# Altium project PCB-PWR.PrjPcb
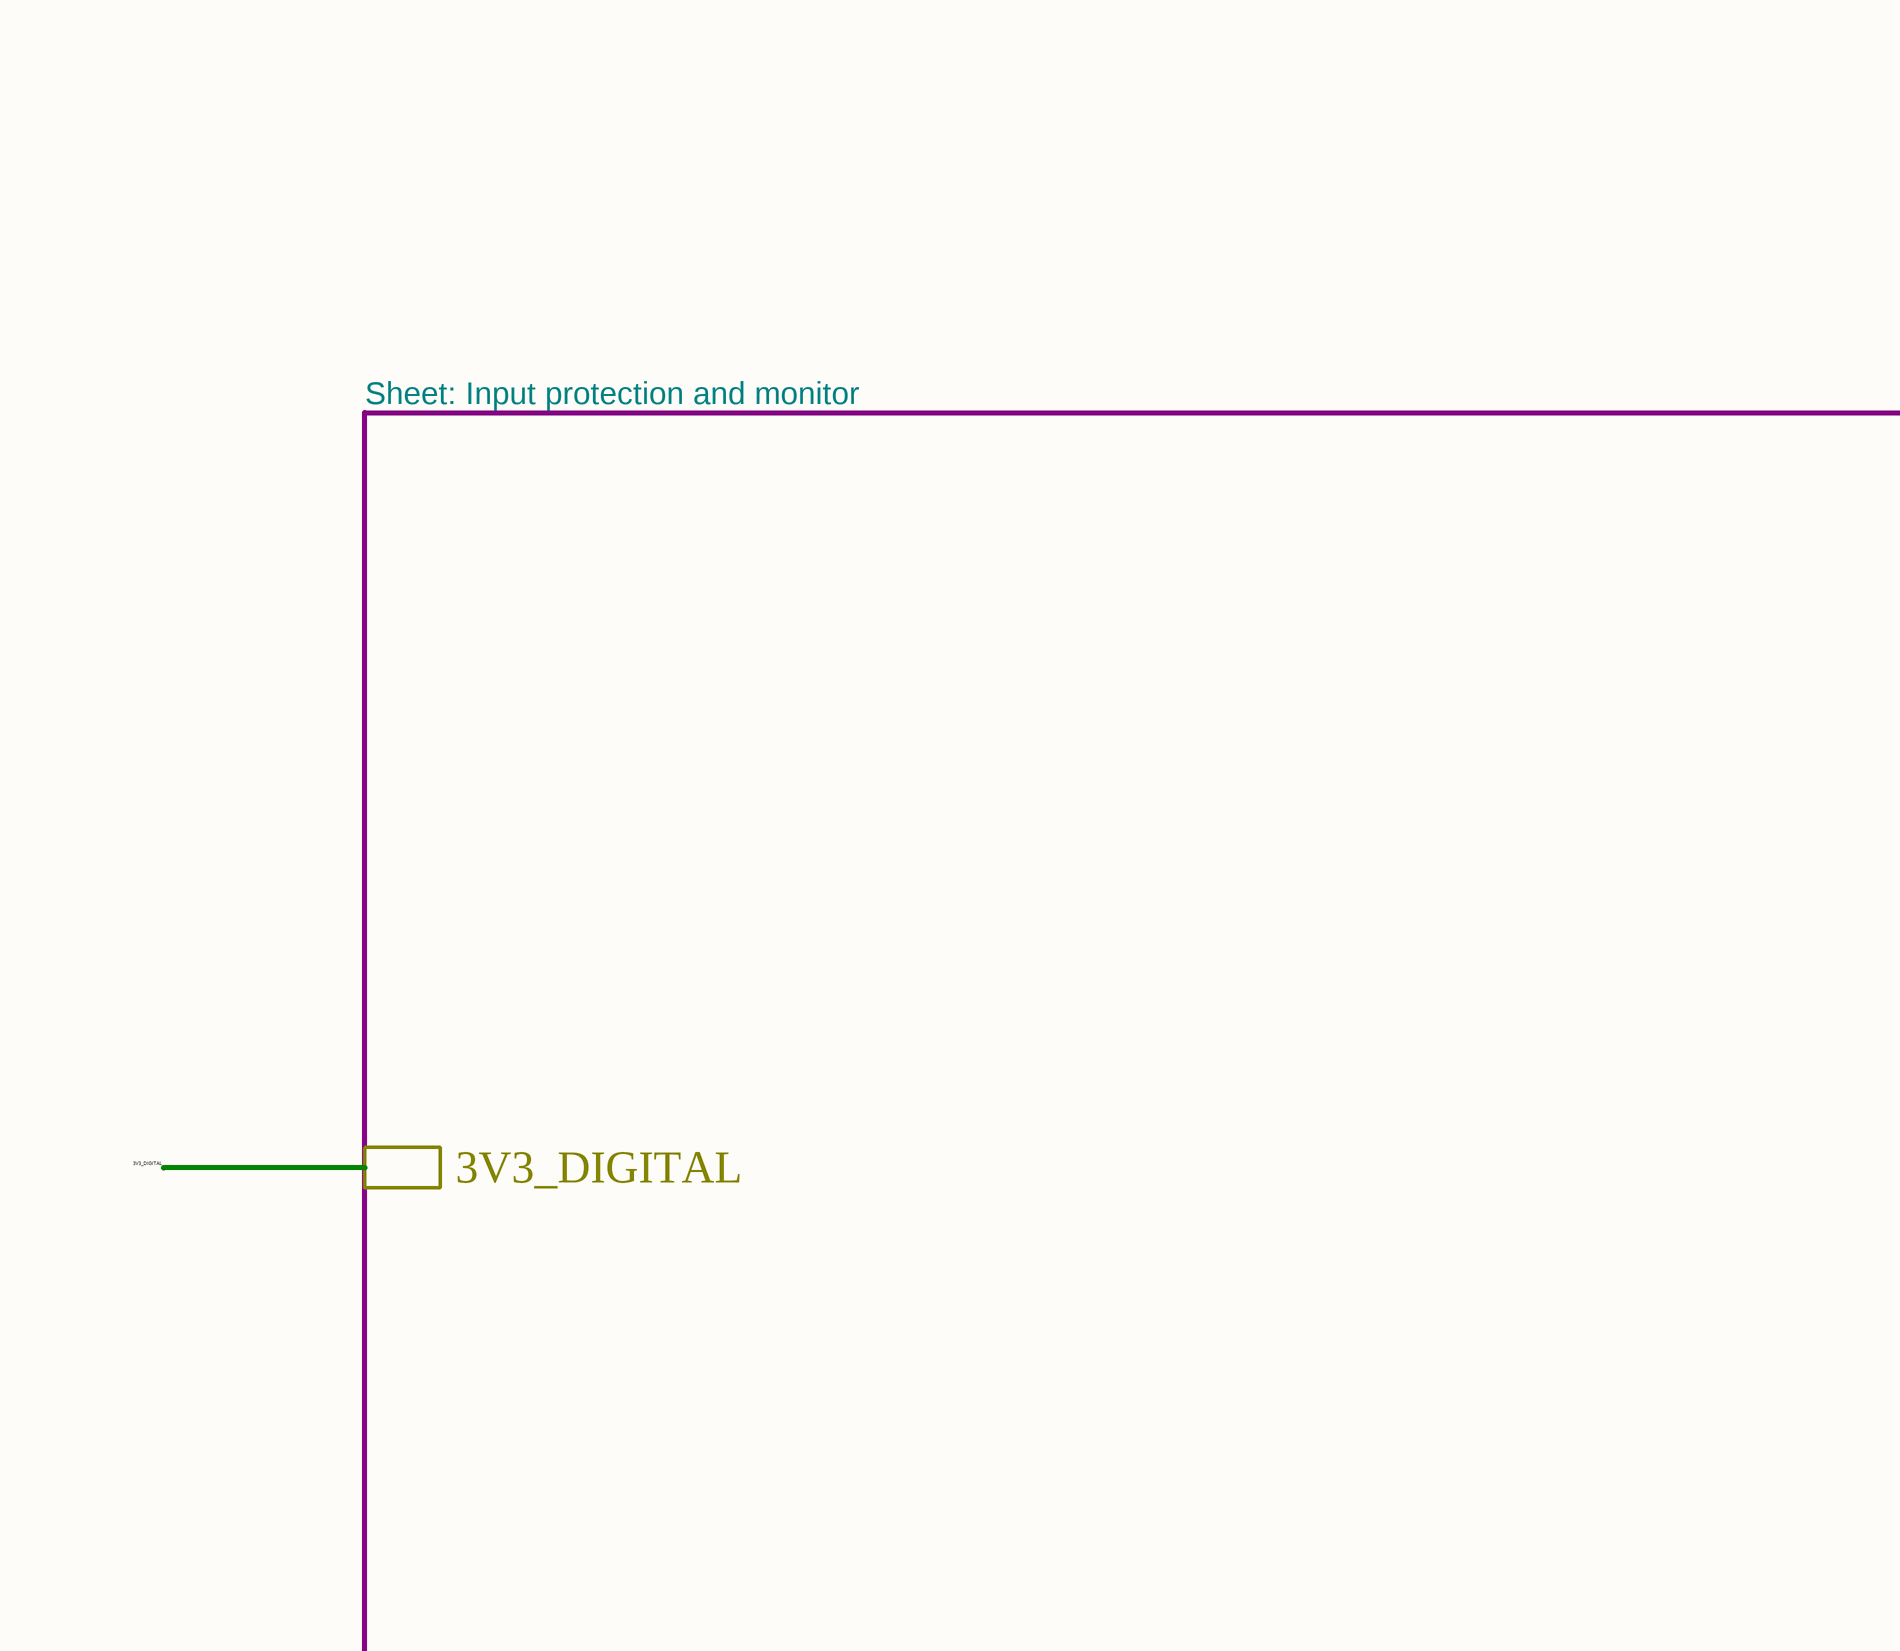
[diagram p0: PCB-PWR.SchDoc, top column 1 of 4]
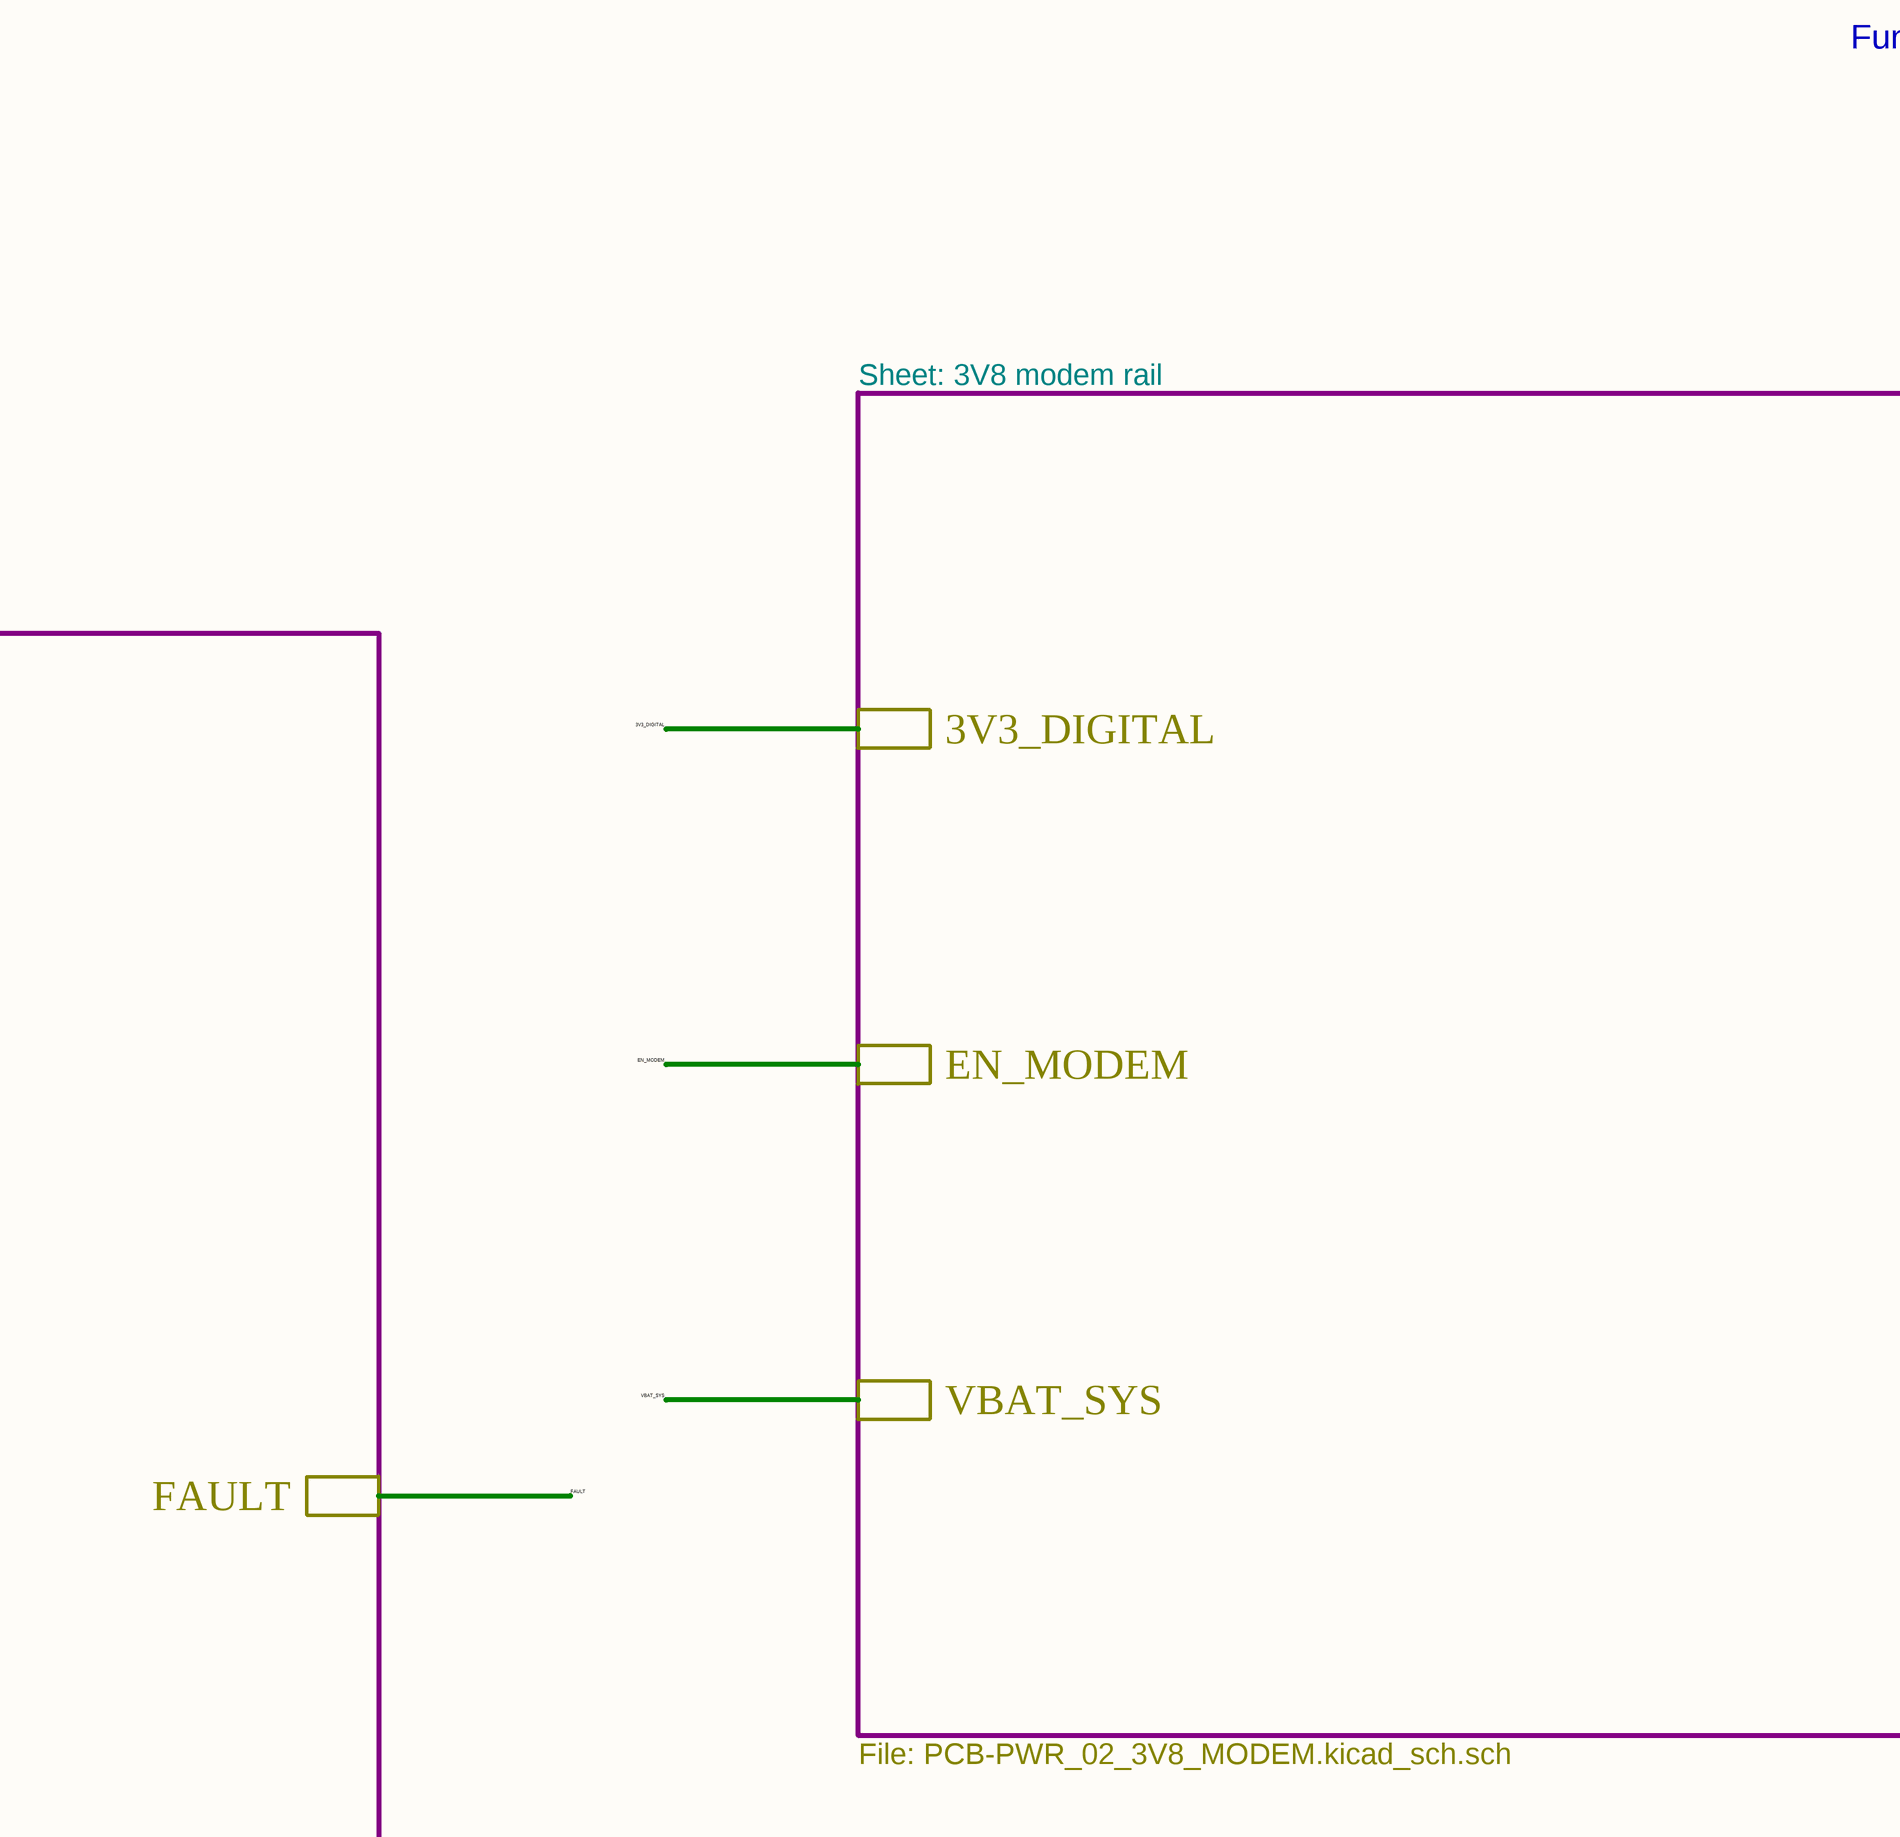
[diagram p1: PCB-PWR.SchDoc, top column 2 of 4]
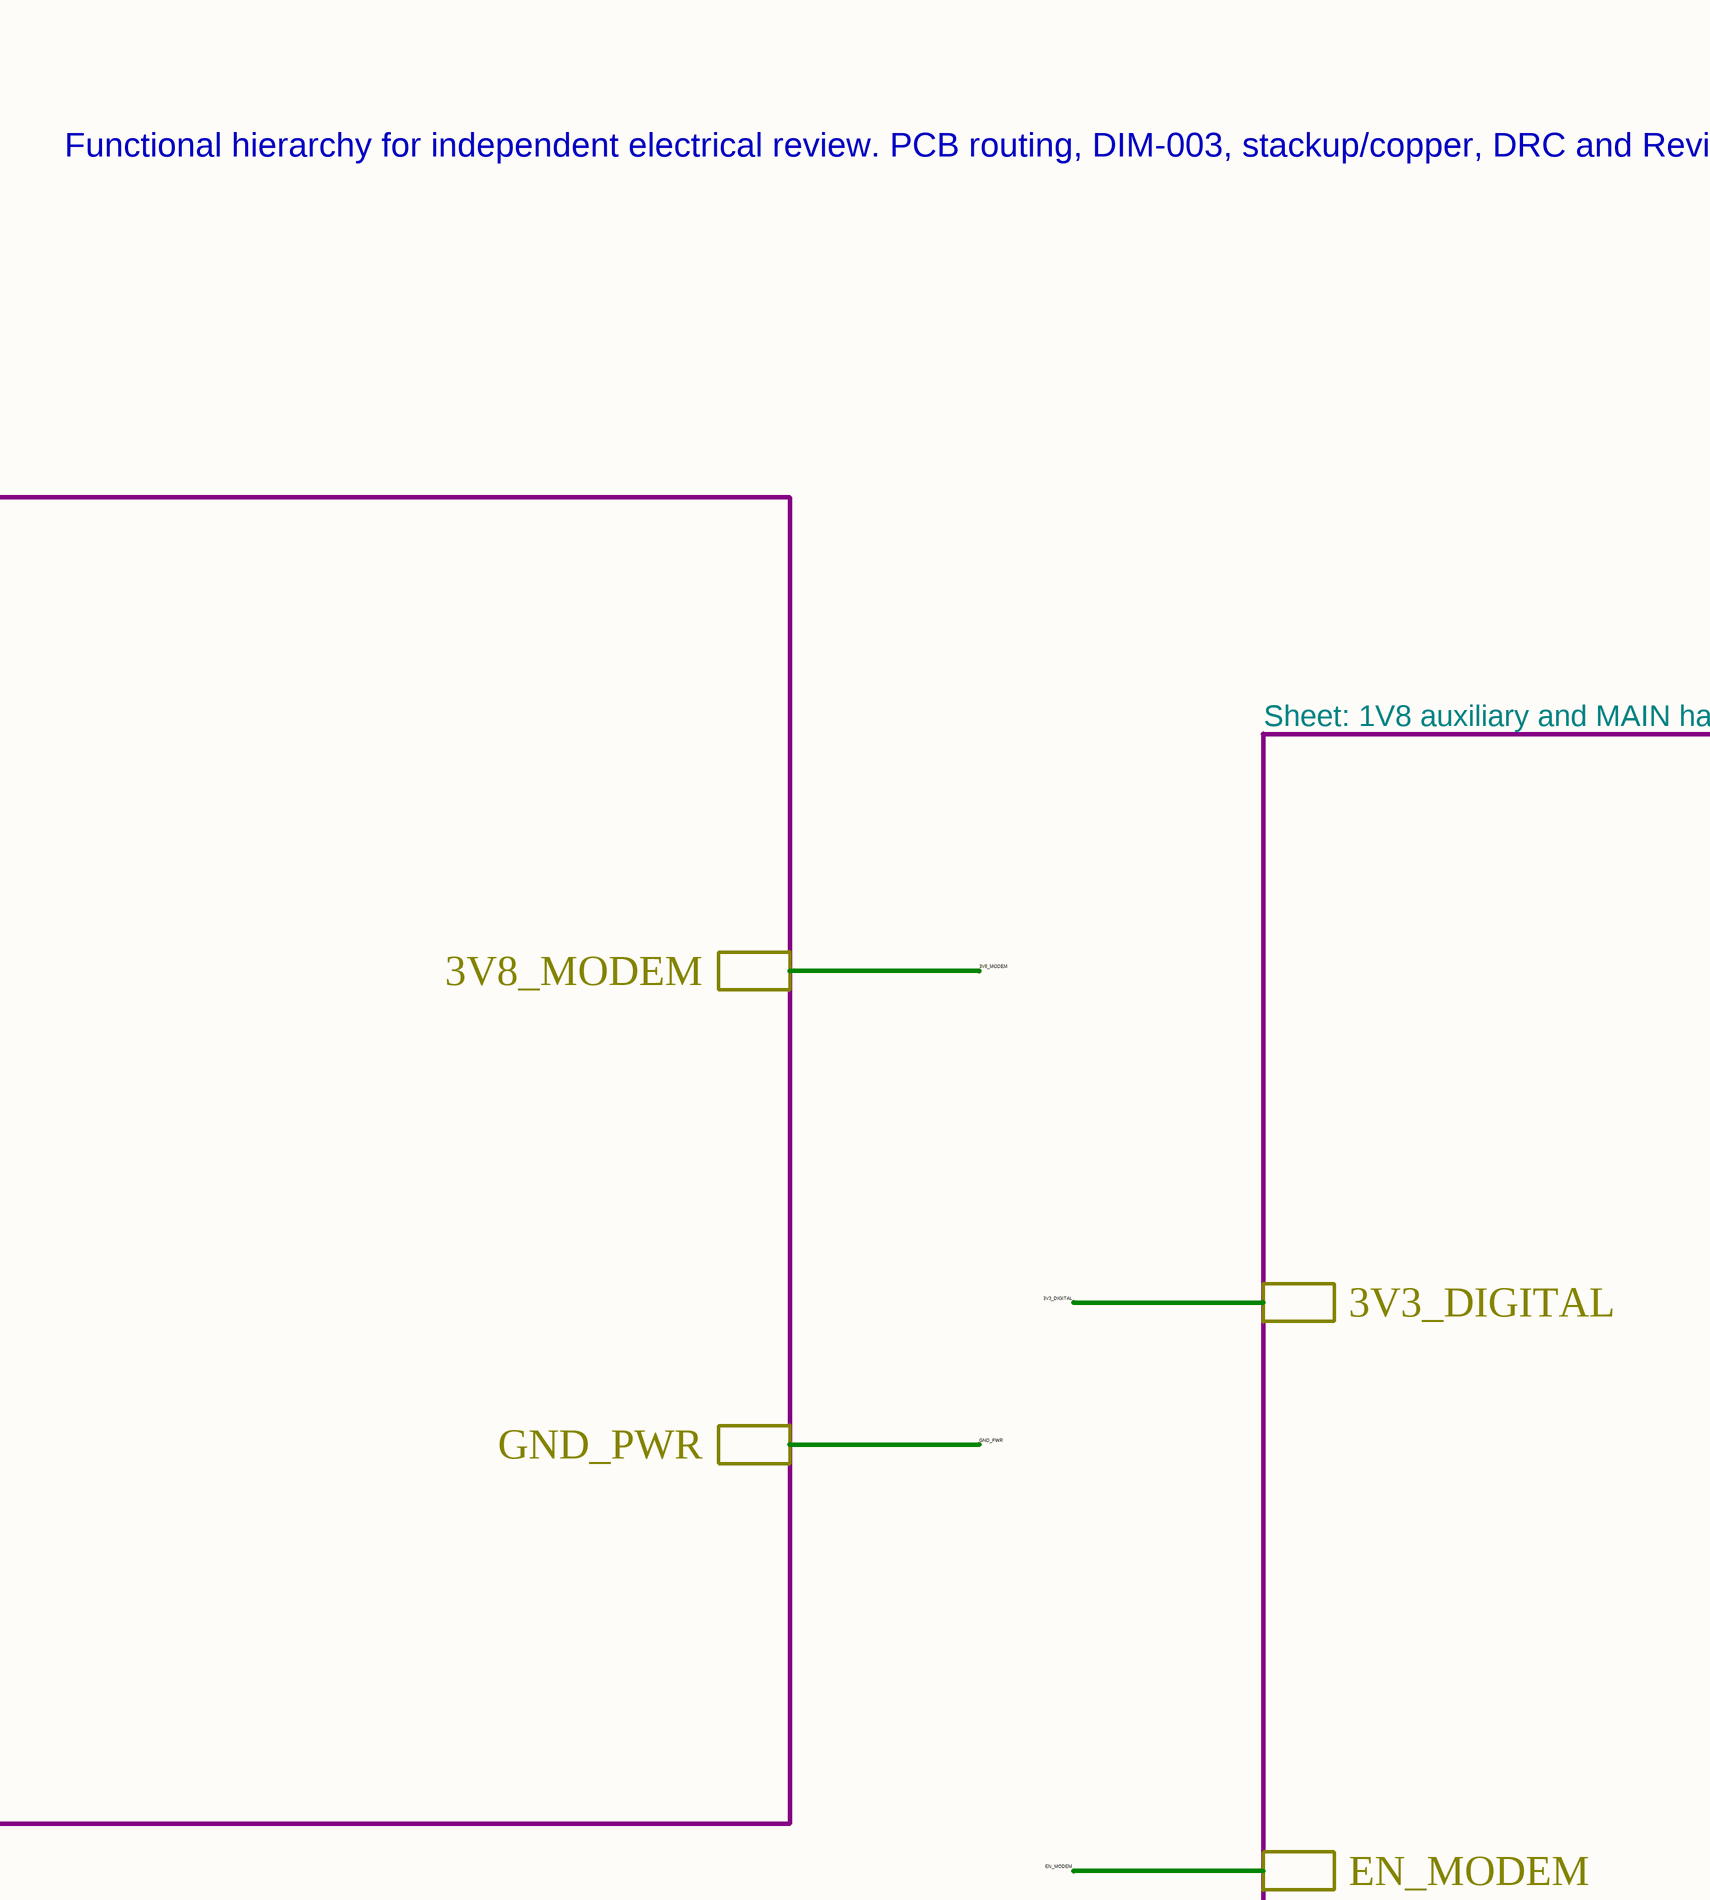
[diagram p2: PCB-PWR.SchDoc, top column 3 of 4]
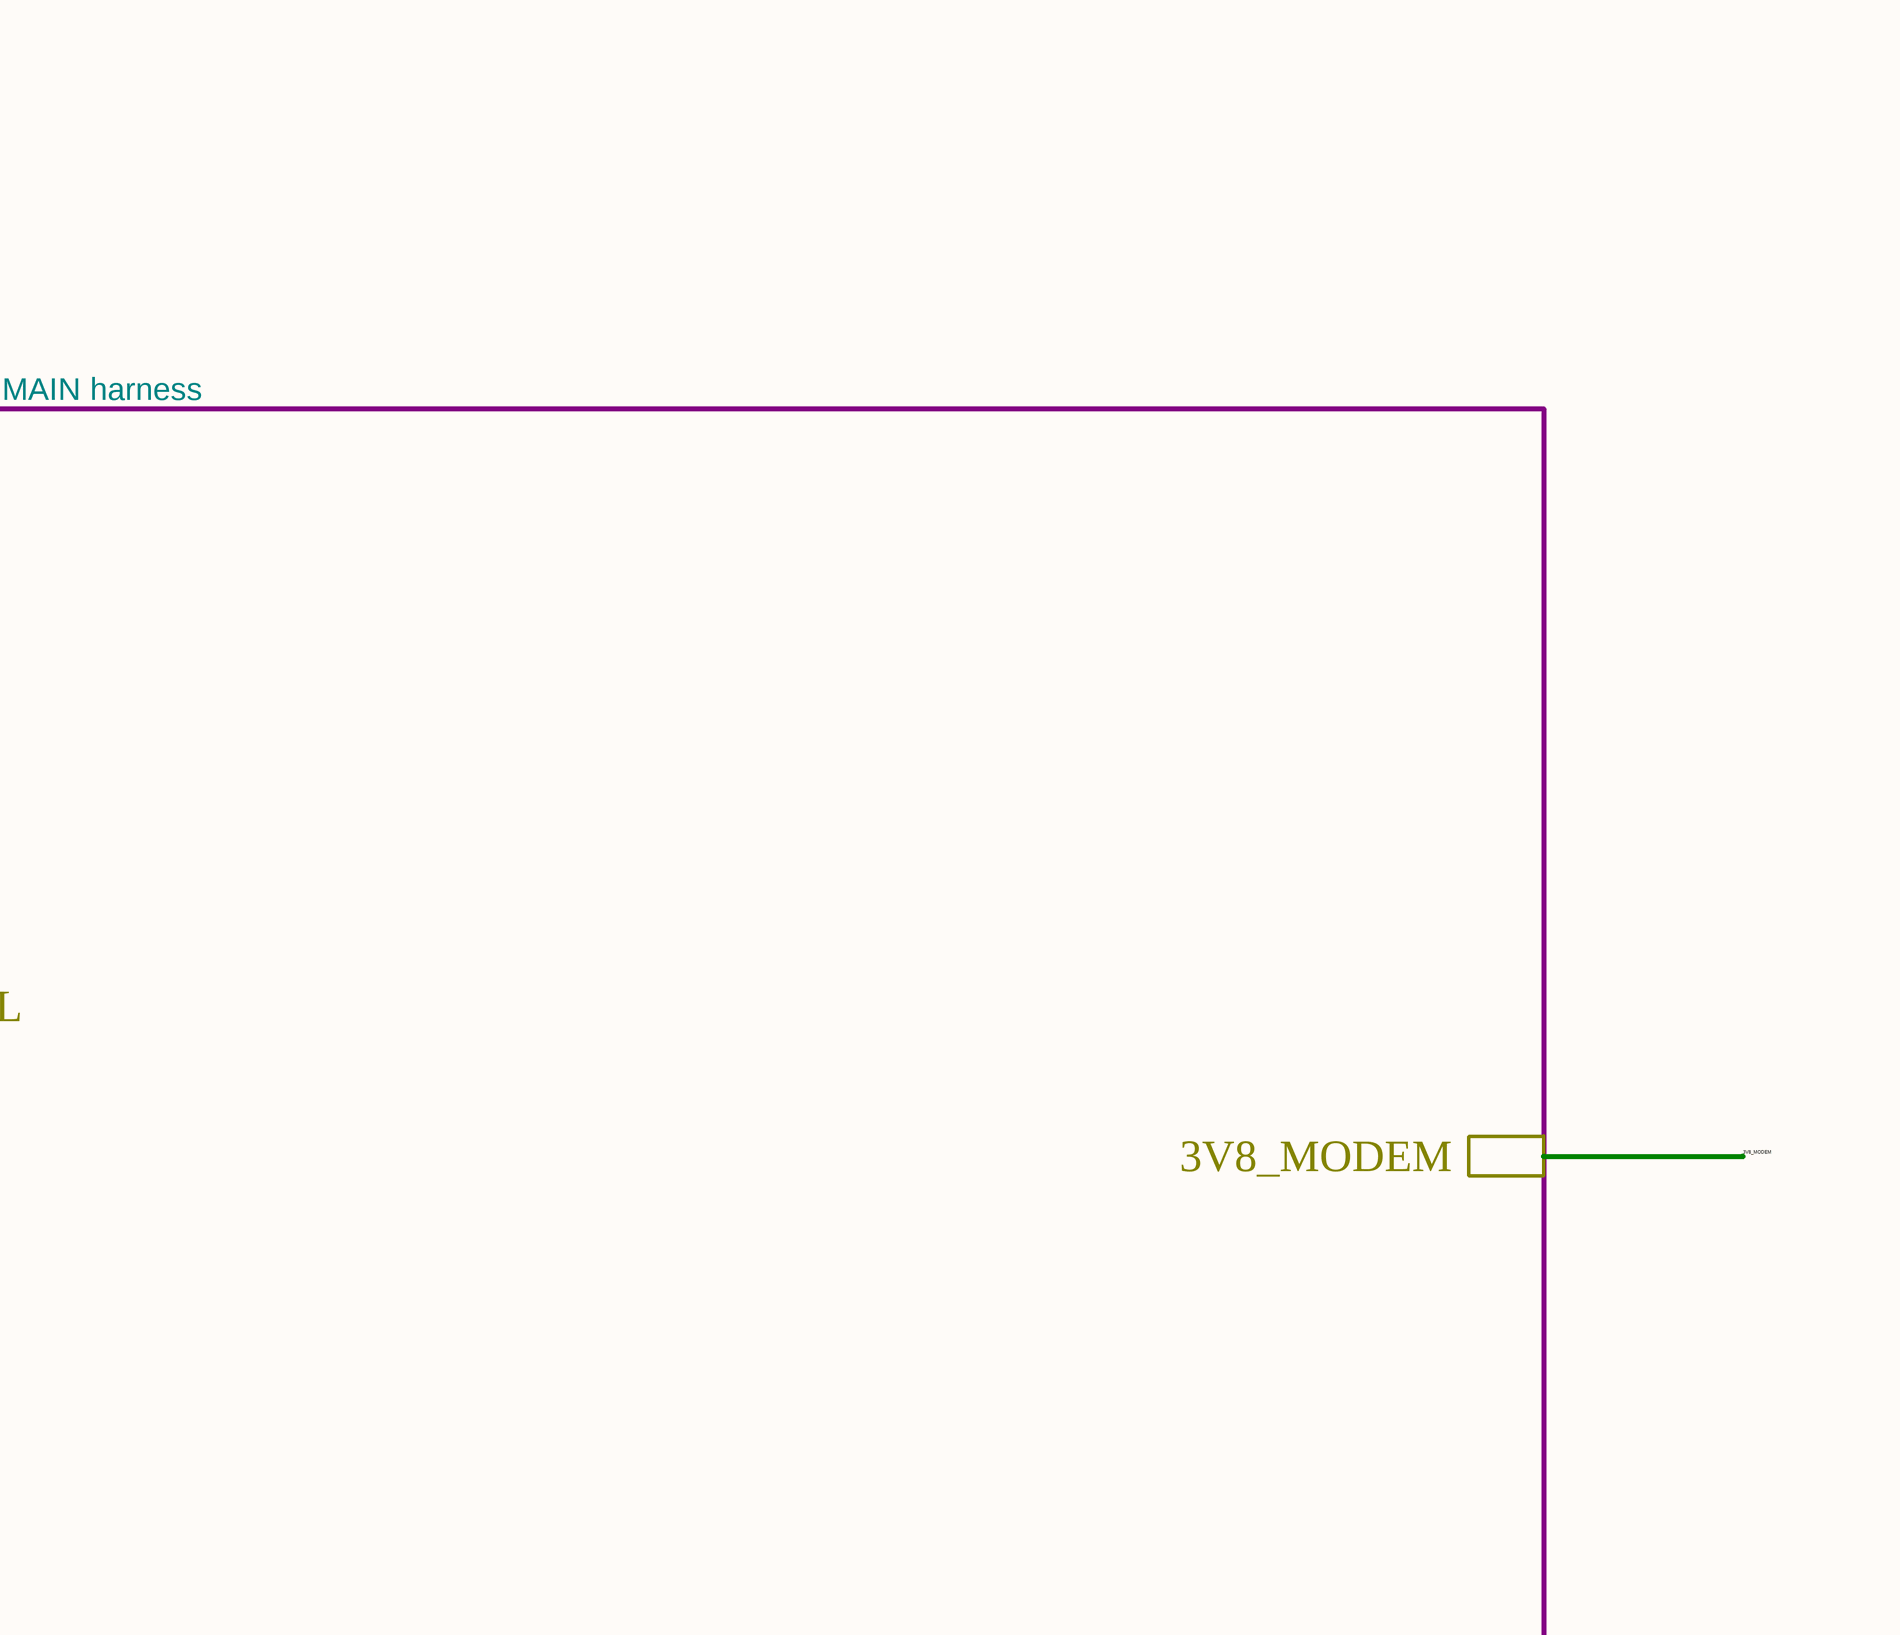
[diagram p3: PCB-PWR.SchDoc, top column 4 of 4]
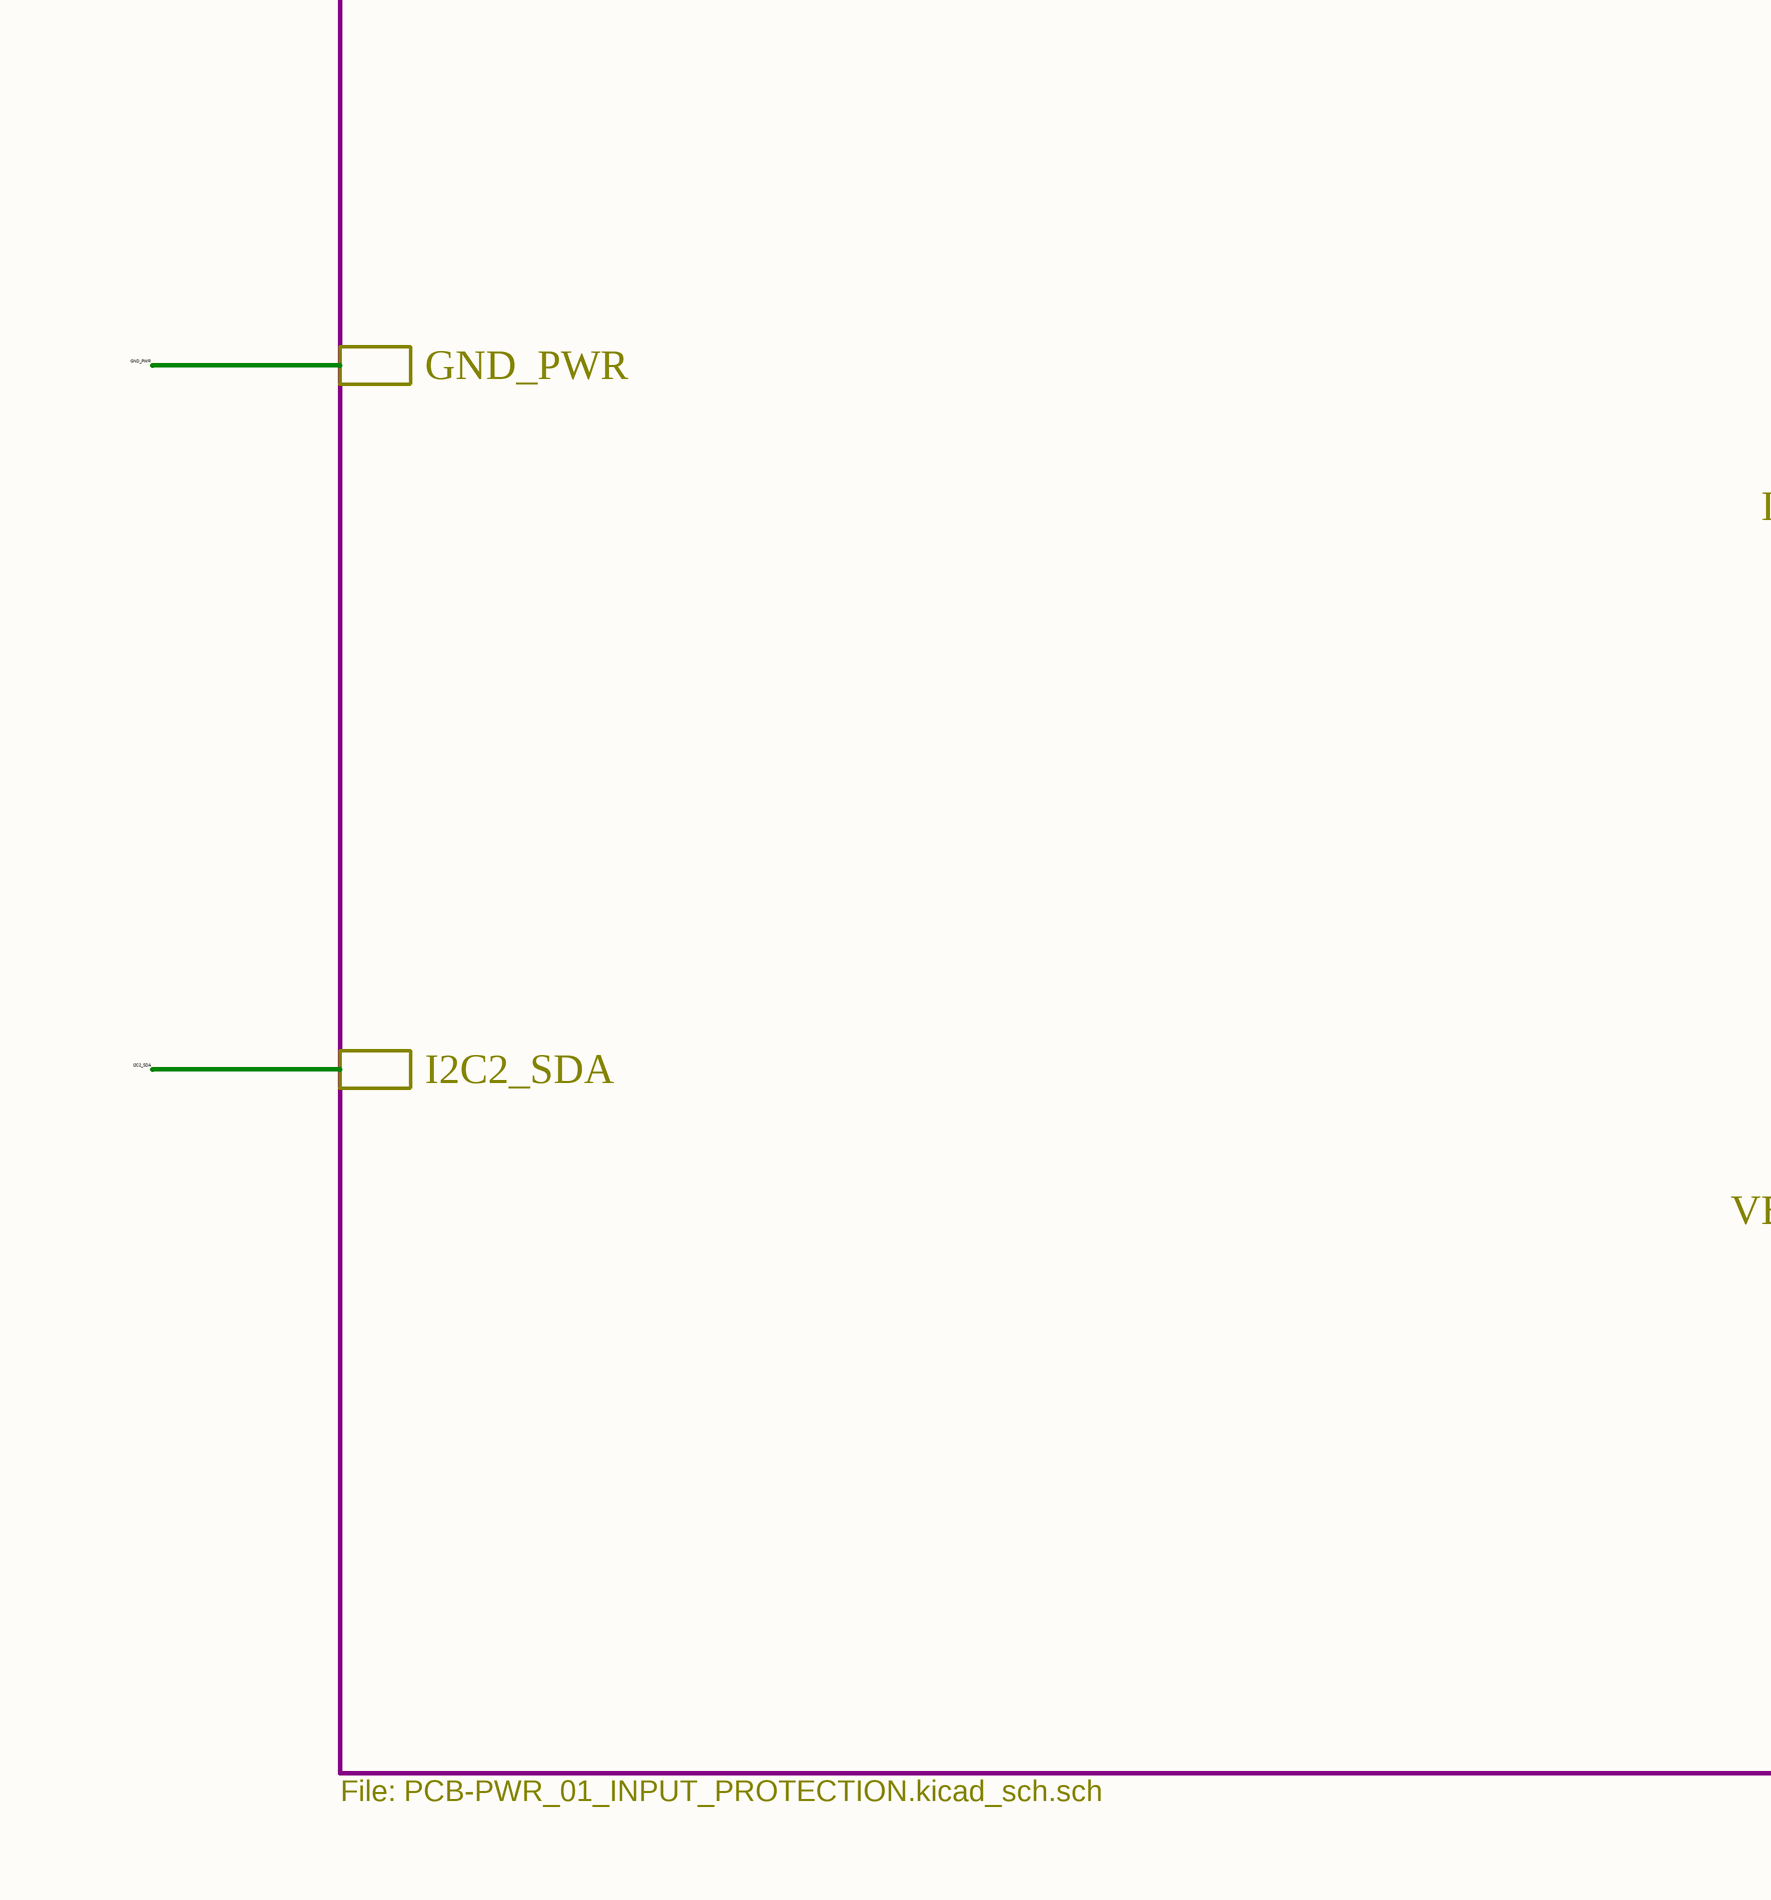
[diagram p4: PCB-PWR.SchDoc, bottom column 1 of 4]
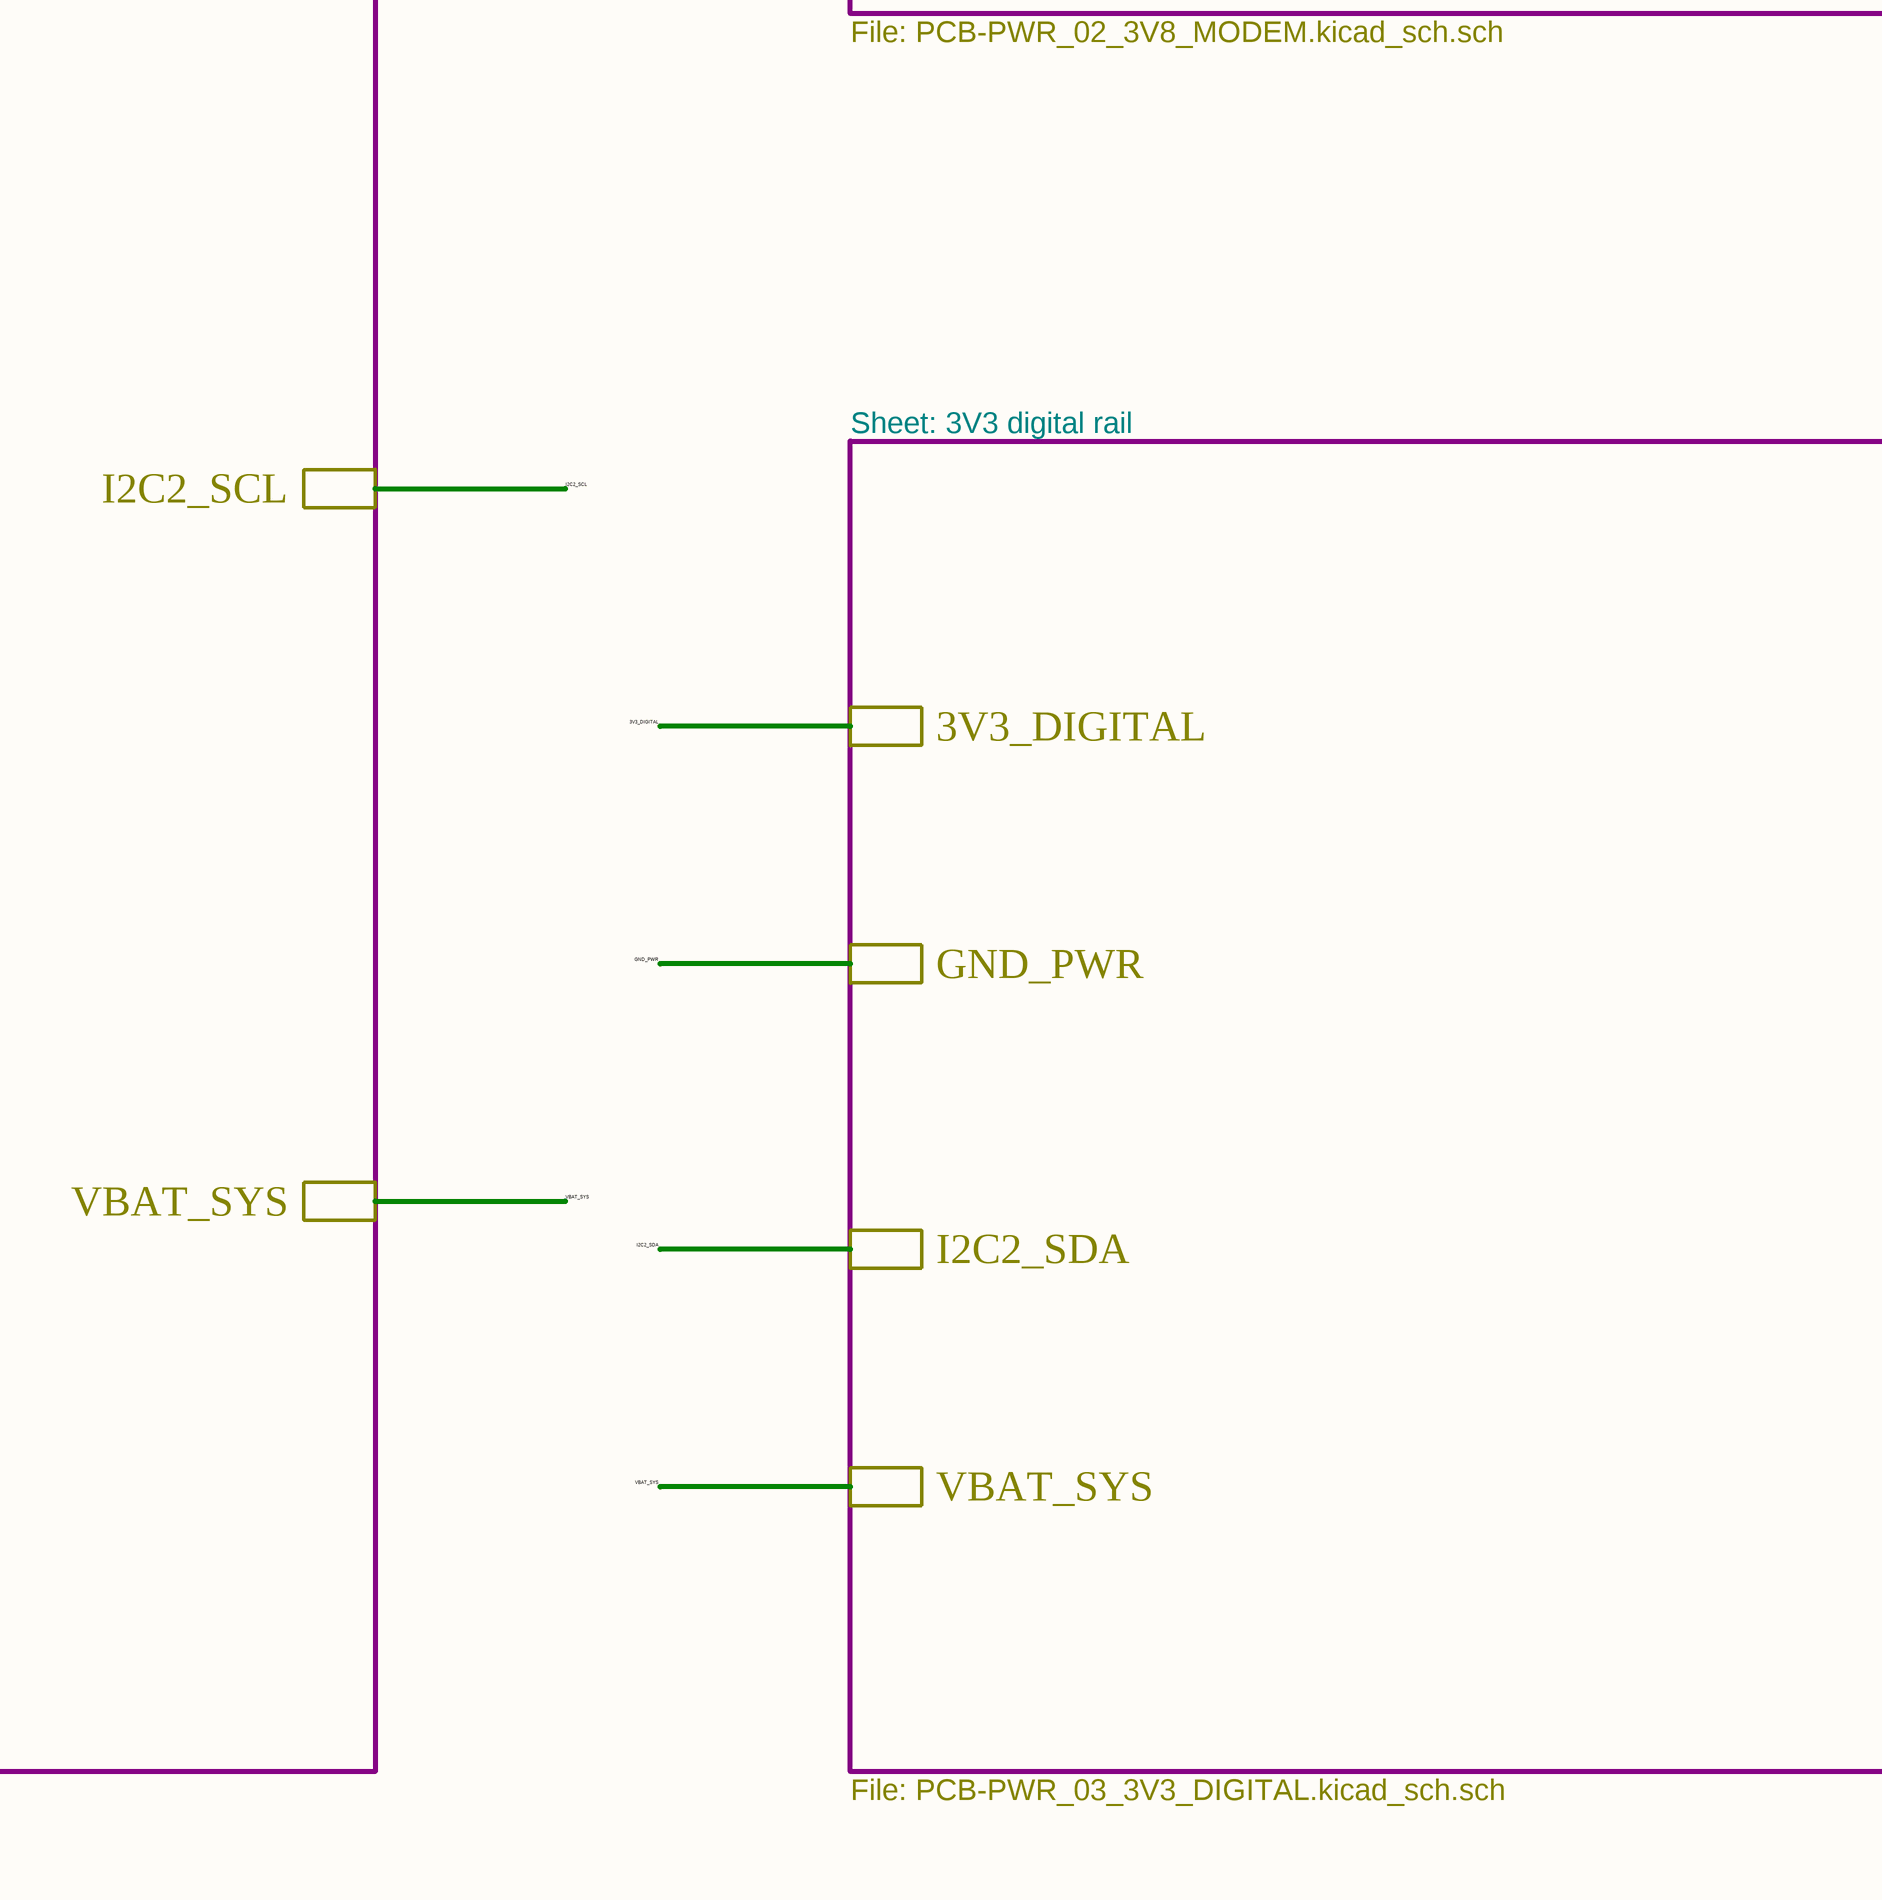
[diagram p5: PCB-PWR.SchDoc, bottom column 2 of 4]
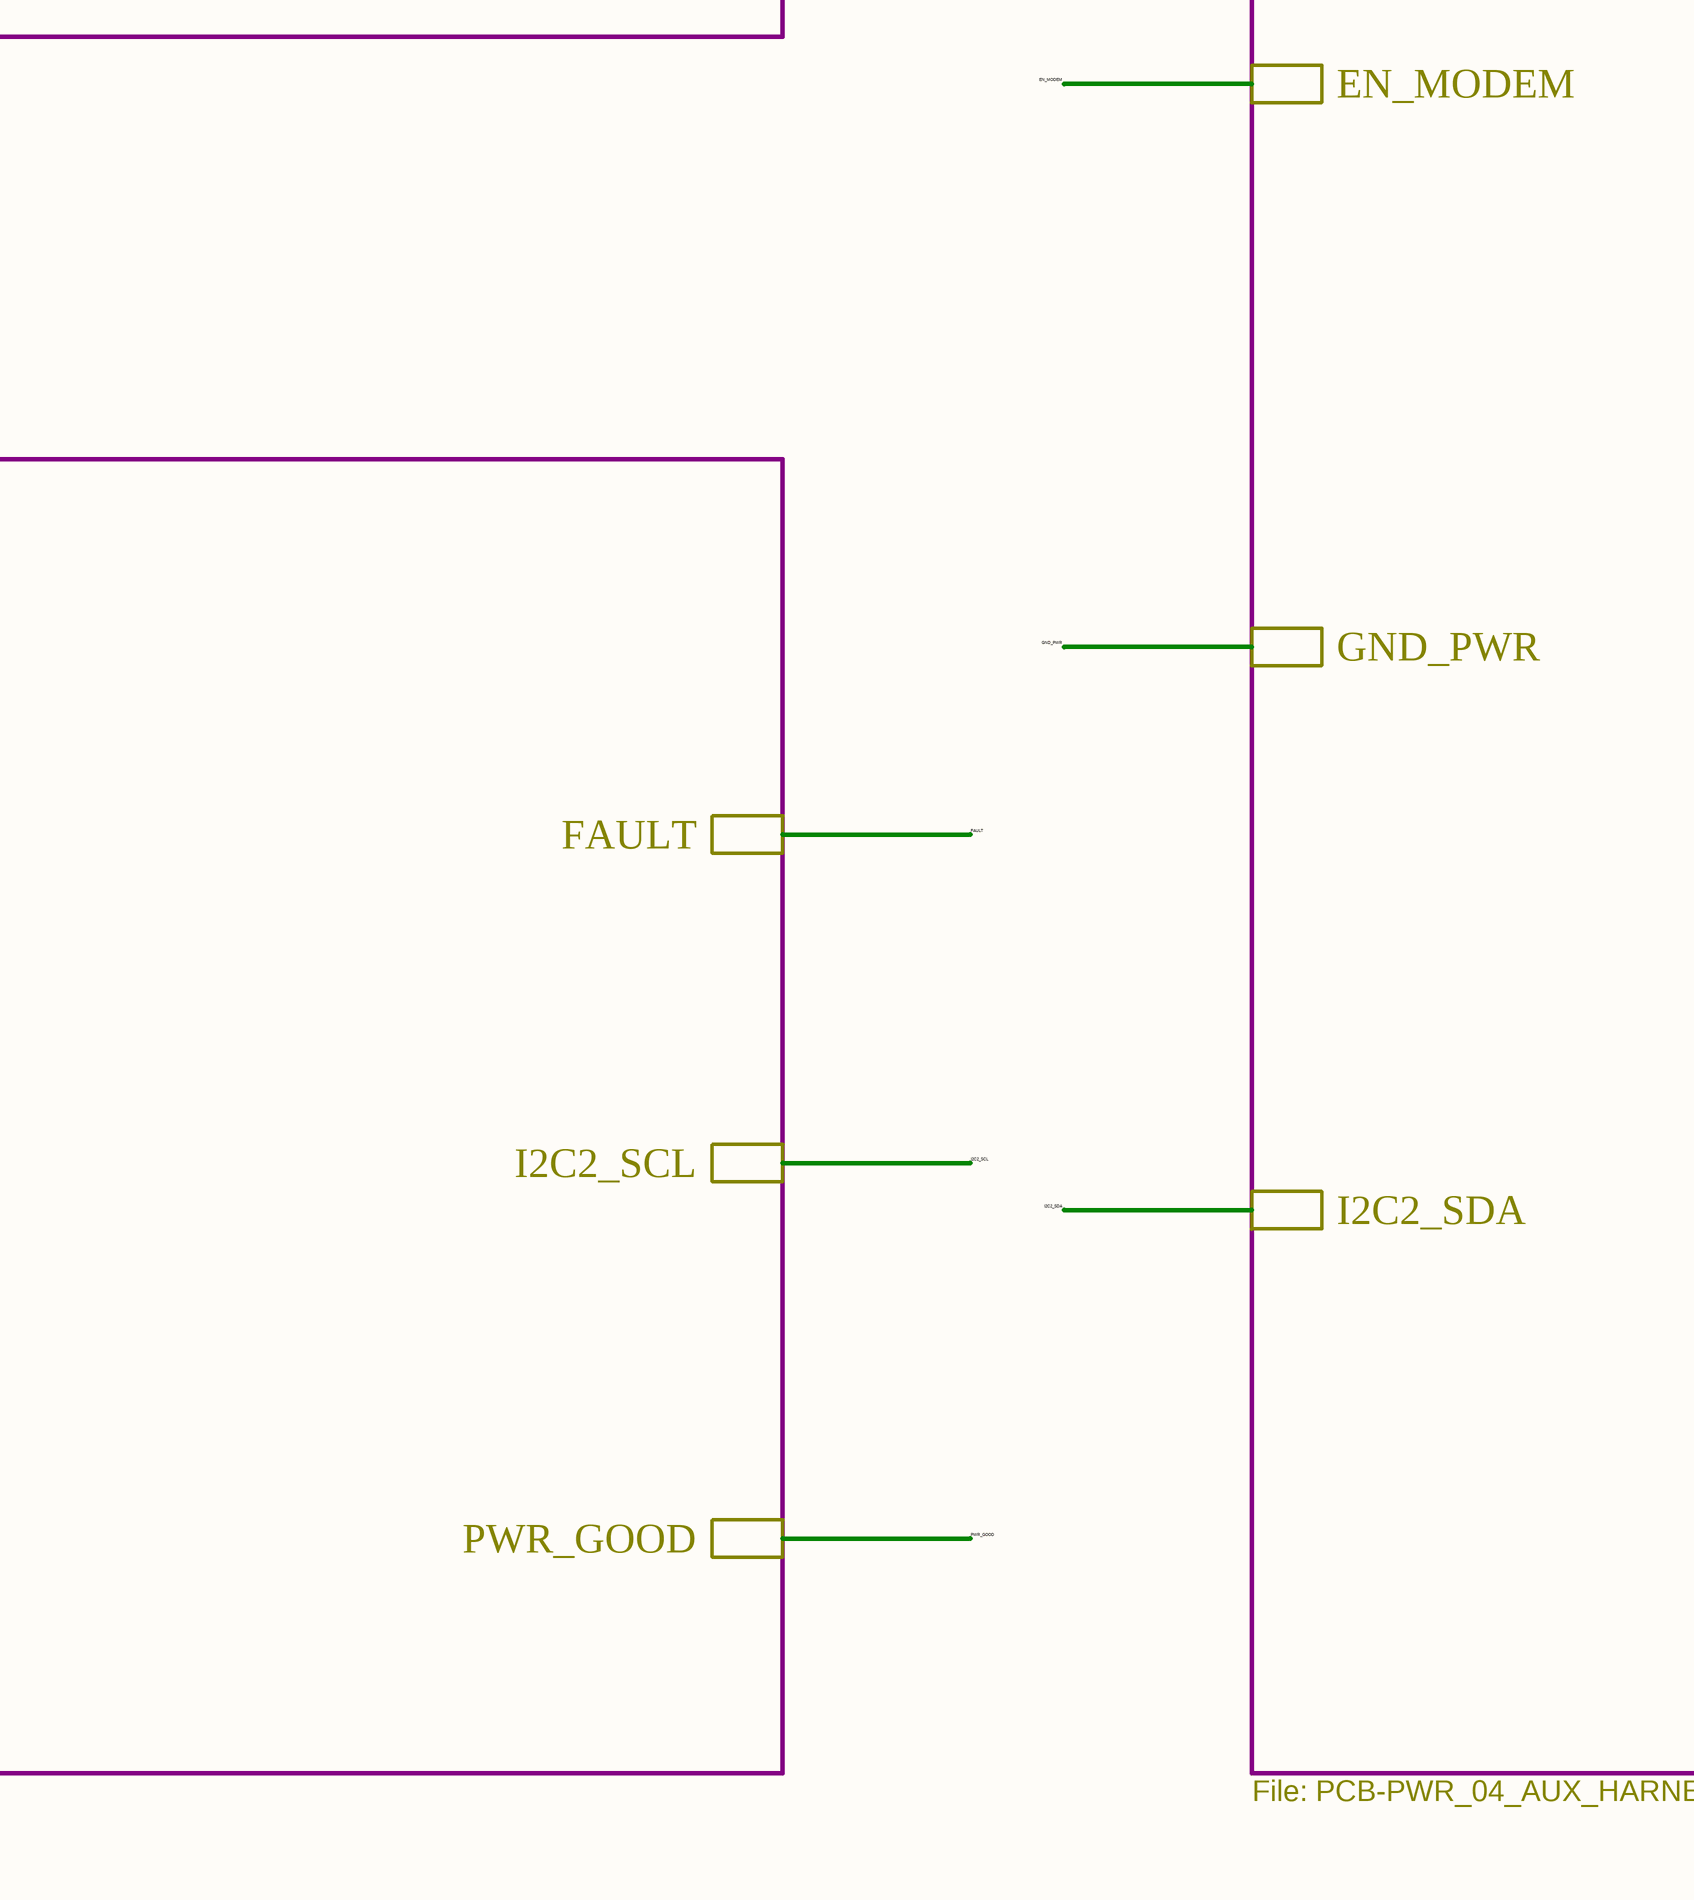
[diagram p6: PCB-PWR.SchDoc, bottom column 3 of 4]
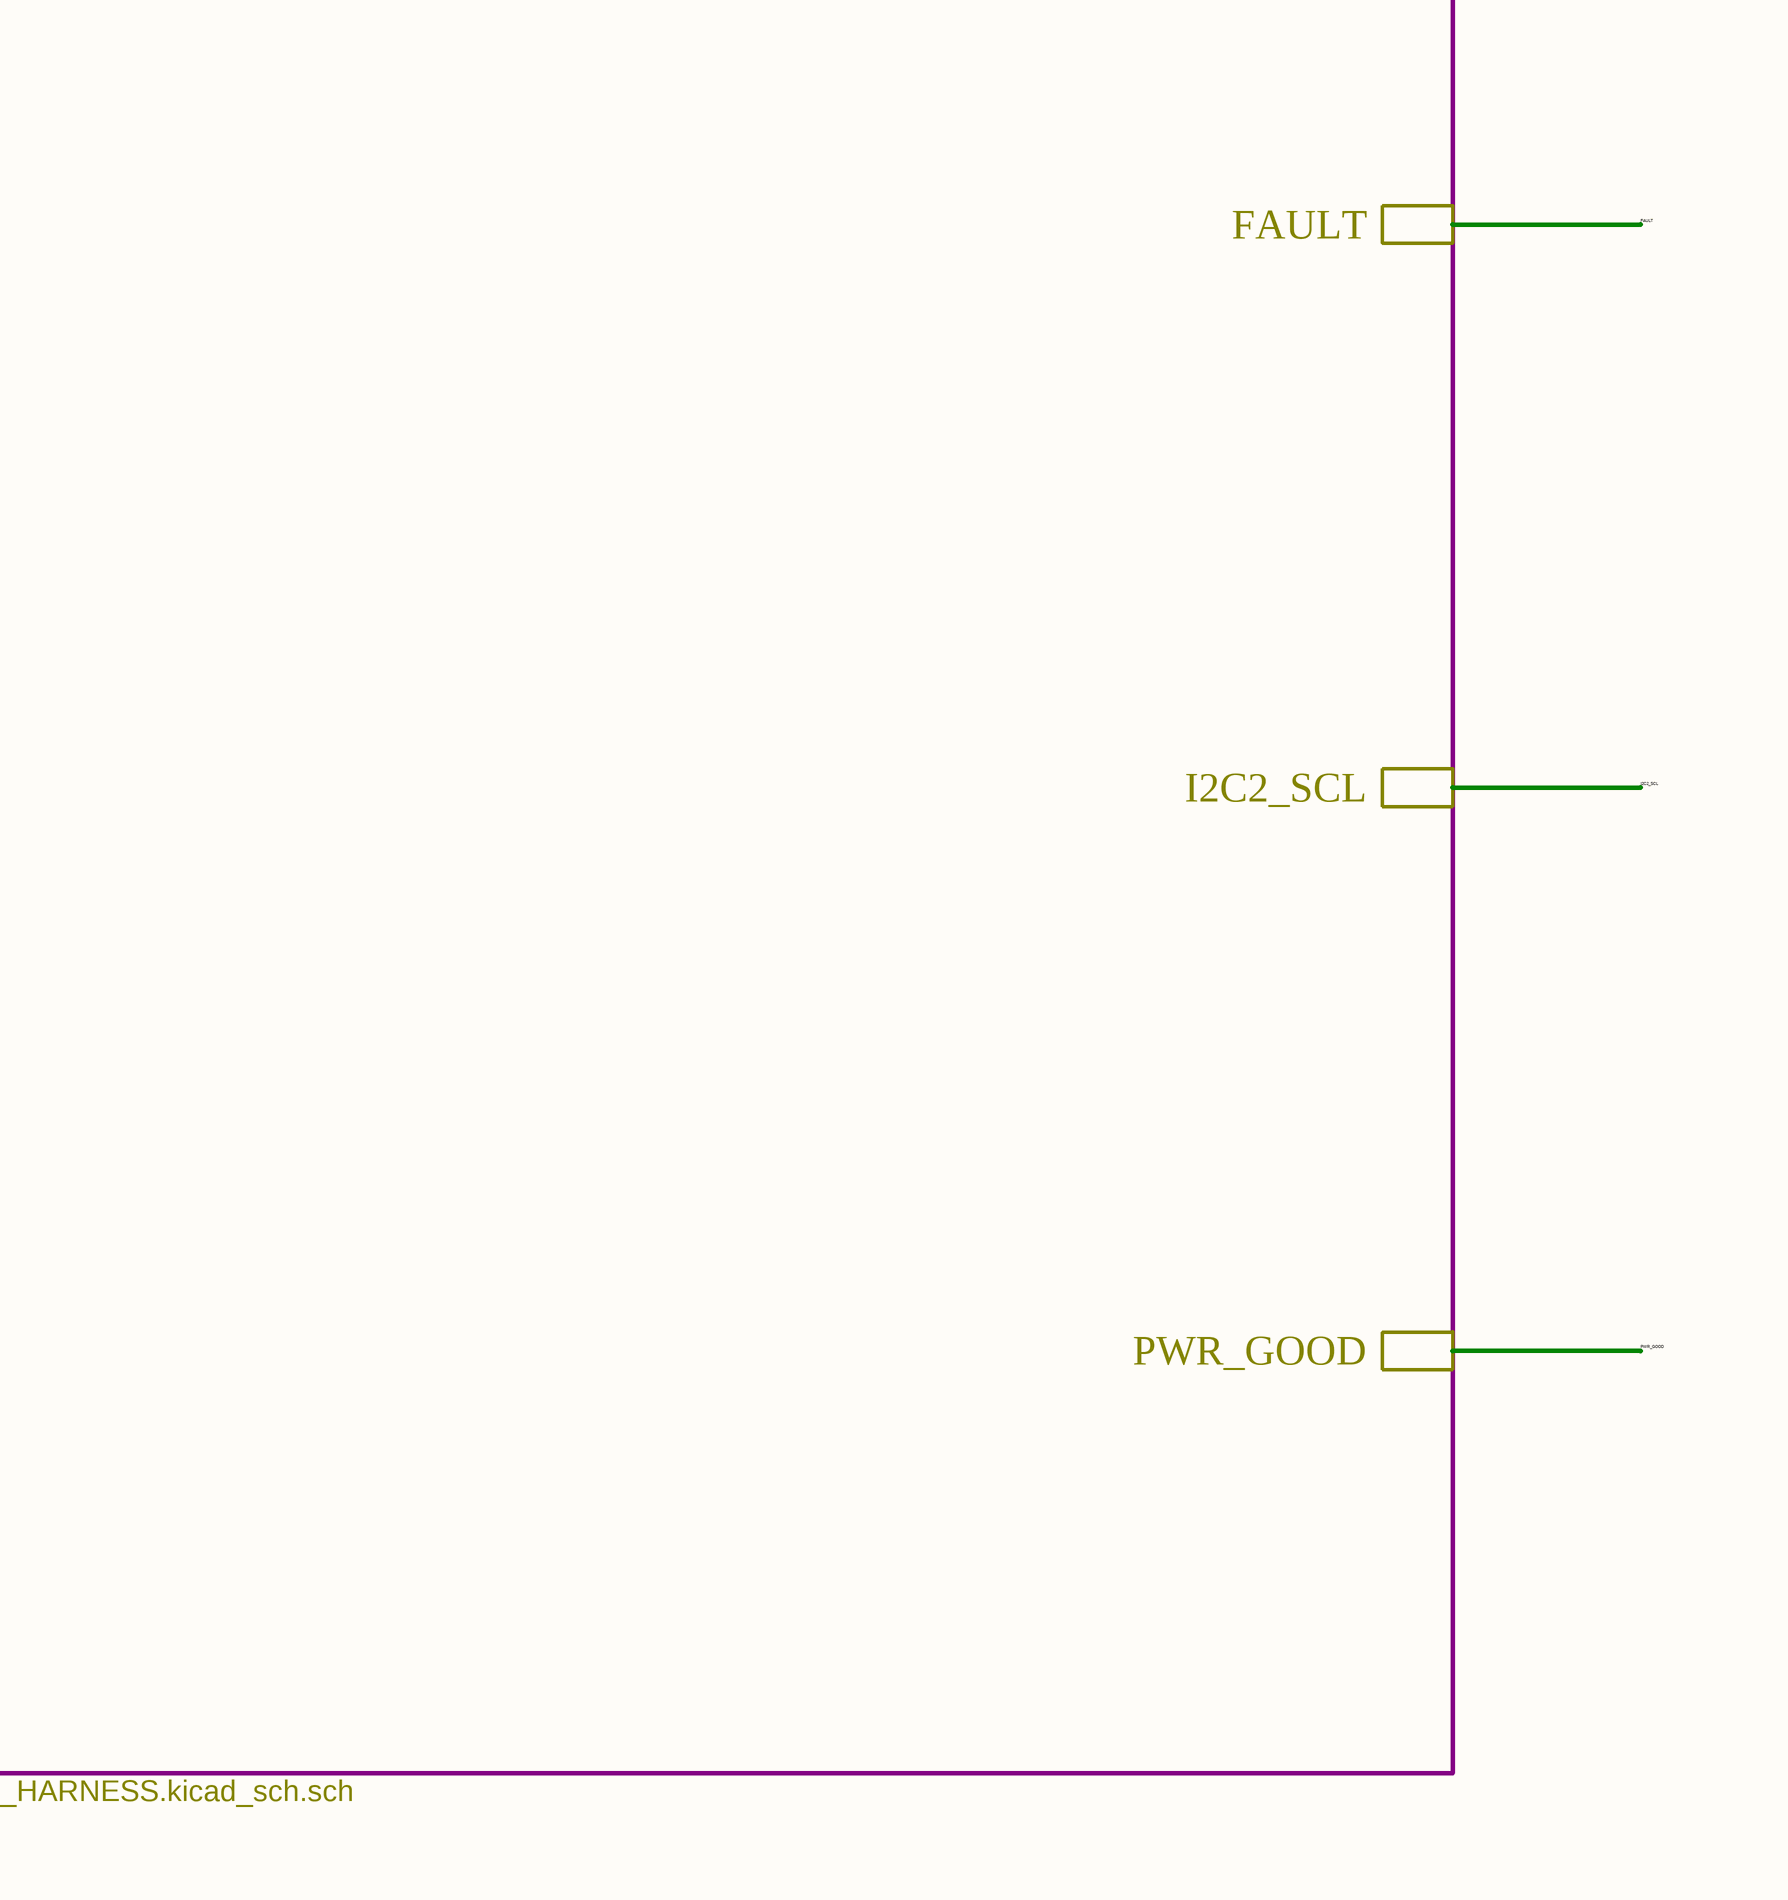
[diagram p7: PCB-PWR.SchDoc, bottom column 4 of 4]
5 sheets, 65 parts. Net scope: hierarchical (ports join the sheet entries above them; power ports are global).
Board file: PCB-PWR.PcbDoc
Sheets:
  PCB-PWR.SchDoc
    Input protection and monitor = PCB-PWR_01_INPUT_PROTECTION.SchDoc
    3V8 modem rail = PCB-PWR_02_3V8_MODEM.SchDoc
    3V3 digital rail = PCB-PWR_03_3V3_DIGITAL.SchDoc
    1V8 auxiliary and MAIN harness = PCB-PWR_04_AUX_HARNESS.SchDoc

## Sheet PCB-PWR.SchDoc
size 420 x 297 mm

### Sub-sheets
1V8 auxiliary and MAIN harness = PCB-PWR_04_AUX_HARNESS.SchDoc: 3V3_DIGITAL, EN_MODEM, GND_PWR, I2C2_SDA, 3V8_MODEM, FAULT, I2C2_SCL, PWR_GOOD
3V3 digital rail = PCB-PWR_03_3V3_DIGITAL.SchDoc: 3V3_DIGITAL, GND_PWR, I2C2_SDA, VBAT_SYS, FAULT, I2C2_SCL, PWR_GOOD
3V8 modem rail = PCB-PWR_02_3V8_MODEM.SchDoc: 3V3_DIGITAL, EN_MODEM, VBAT_SYS, 3V8_MODEM, GND_PWR
Input protection and monitor = PCB-PWR_01_INPUT_PROTECTION.SchDoc: 3V3_DIGITAL, GND_PWR, I2C2_SDA, FAULT, I2C2_SCL, VBAT_SYS

### Nets
3V3_DIGITAL: sheet Input protection and monitor/3V3_DIGITAL, sheet 3V8 modem rail/3V3_DIGITAL, sheet 3V3 digital rail/3V3_DIGITAL, sheet 1V8 auxiliary and MAIN harness/3V3_DIGITAL
3V8_MODEM: sheet 3V8 modem rail/3V8_MODEM, sheet 1V8 auxiliary and MAIN harness/3V8_MODEM
EN_MODEM: sheet 3V8 modem rail/EN_MODEM, sheet 1V8 auxiliary and MAIN harness/EN_MODEM
FAULT: sheet Input protection and monitor/FAULT, sheet 3V3 digital rail/FAULT, sheet 1V8 auxiliary and MAIN harness/FAULT
GND_PWR: sheet Input protection and monitor/GND_PWR, sheet 3V8 modem rail/GND_PWR, sheet 3V3 digital rail/GND_PWR, sheet 1V8 auxiliary and MAIN harness/GND_PWR
I2C2_SCL: sheet Input protection and monitor/I2C2_SCL, sheet 3V3 digital rail/I2C2_SCL, sheet 1V8 auxiliary and MAIN harness/I2C2_SCL
I2C2_SDA: sheet Input protection and monitor/I2C2_SDA, sheet 3V3 digital rail/I2C2_SDA, sheet 1V8 auxiliary and MAIN harness/I2C2_SDA
PWR_GOOD: sheet 3V3 digital rail/PWR_GOOD, sheet 1V8 auxiliary and MAIN harness/PWR_GOOD
VBAT_SYS: sheet Input protection and monitor/VBAT_SYS, sheet 3V8 modem rail/VBAT_SYS, sheet 3V3 digital rail/VBAT_SYS

### Notes on the sheet
- Functional hierarchy for independent electrical review. PCB routing, DIM-003, stackup/copper, DRC and Review B remain open.
- Sheet: 3V8 modem rail
- Sheet: Input protection and monitor
- Sheet: 1V8 auxiliary and MAIN harness
- File: PCB-PWR_02_3V8_MODEM.kicad_sch.sch
- Sheet: 3V3 digital rail
- File: PCB-PWR_01_INPUT_PROTECTION.kicad_sch.sch
- File: PCB-PWR_03_3V3_DIGITAL.kicad_sch.sch
- File: PCB-PWR_04_AUX_HARNESS.kicad_sch.sch
- 1
- 2
- 3
- 4
- 5
- 6
- 7
- 8
- A
- B
- C
- D
- E
- Human-readable hierarchy; exact pin/net equivalence enforced
- Root sheet 1 of 5
- NOT FOR MANUFACTURE - routing/DRC/DFM/Review B pending
- Title: PCB-PWR system overview
- File: PCB-PWR.kicad_sch
- Sheet: /
- Dioneya / ZS-BPLA
- F
- KiCad E.D.A.  kicad (5.1.4)-1
- Size: A3
- Date: 2026-09-17
- Rev: A
- Id: 1/1

## Sheet PCB-PWR_01_INPUT_PROTECTION.SchDoc
size 420 x 297 mm
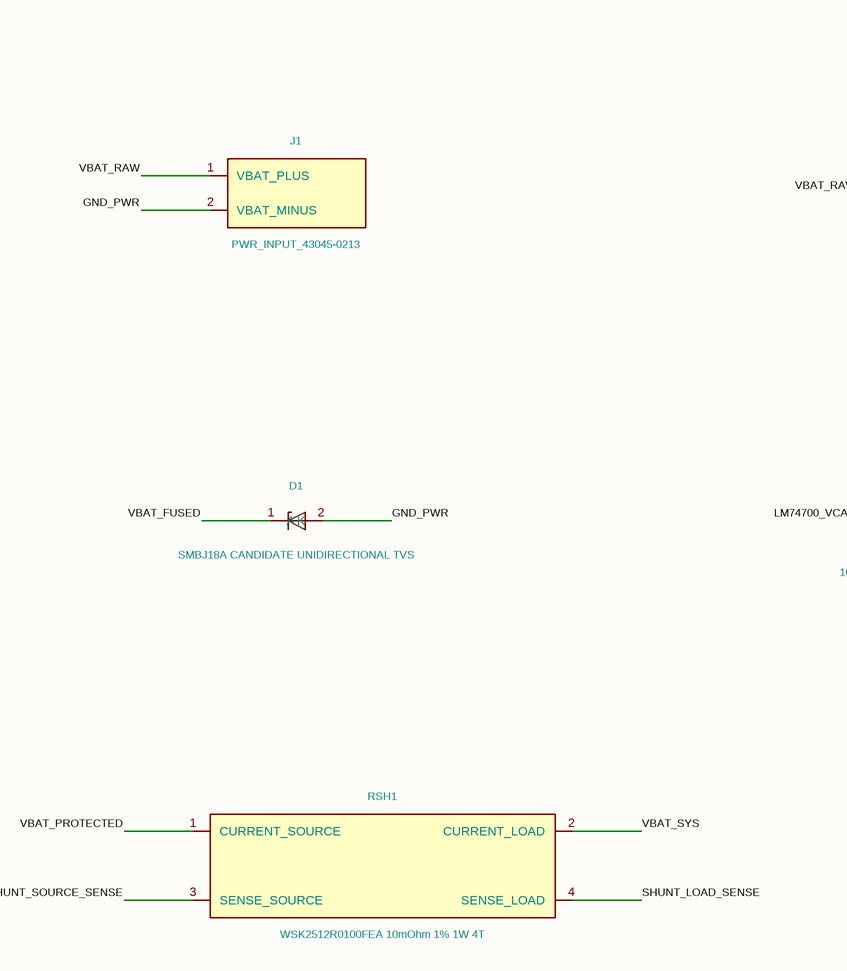
[diagram p8: PCB-PWR_01_INPUT_PROTECTION.SchDoc, top left]
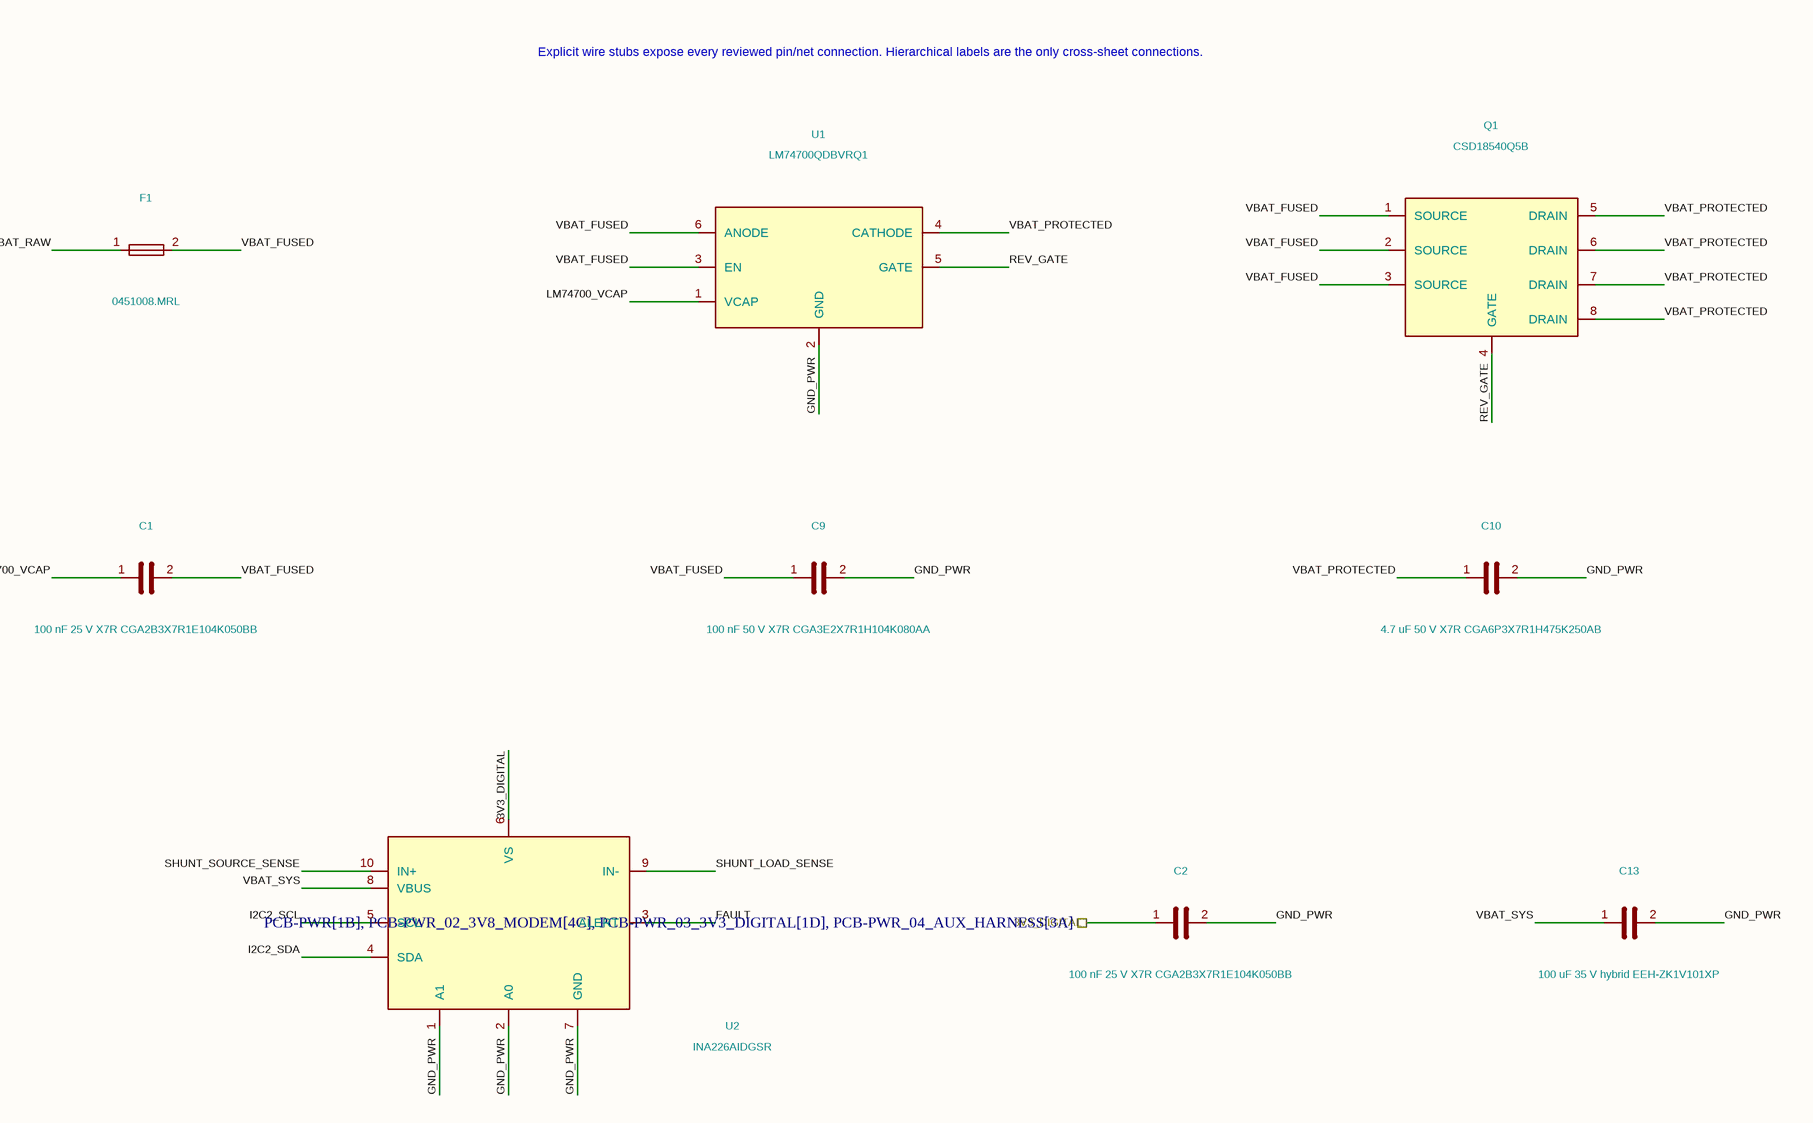
[diagram p9: PCB-PWR_01_INPUT_PROTECTION.SchDoc, top right]
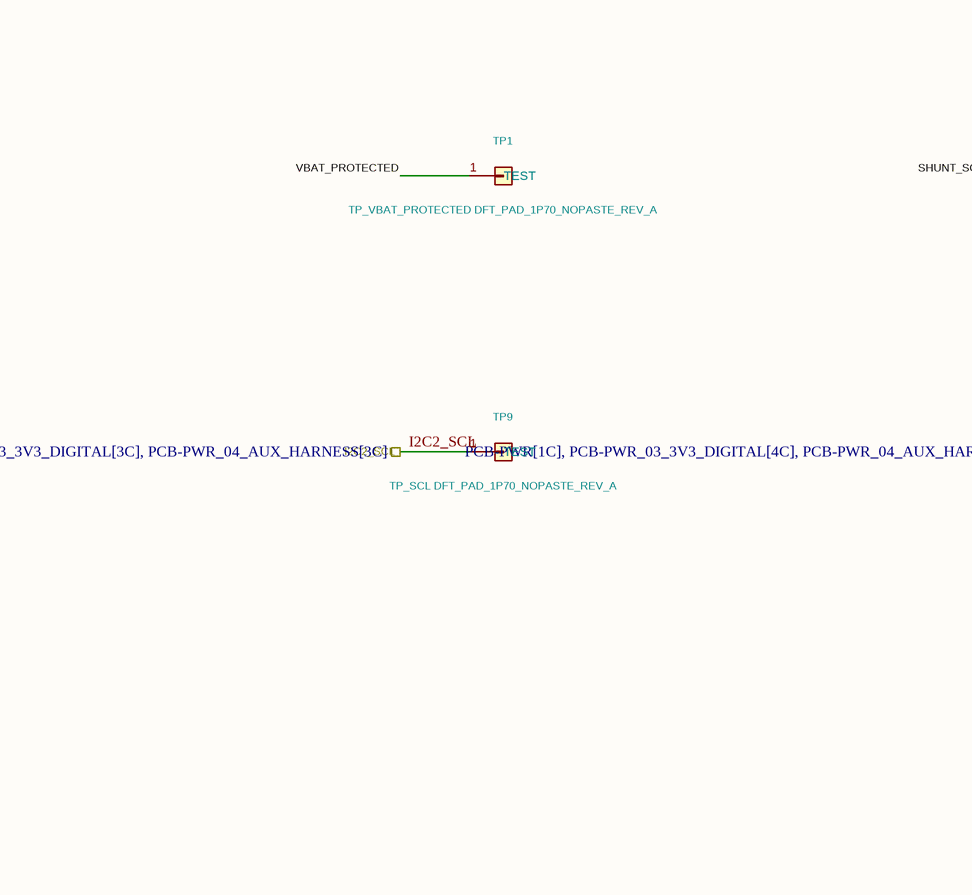
[diagram p10: PCB-PWR_01_INPUT_PROTECTION.SchDoc, bottom left]
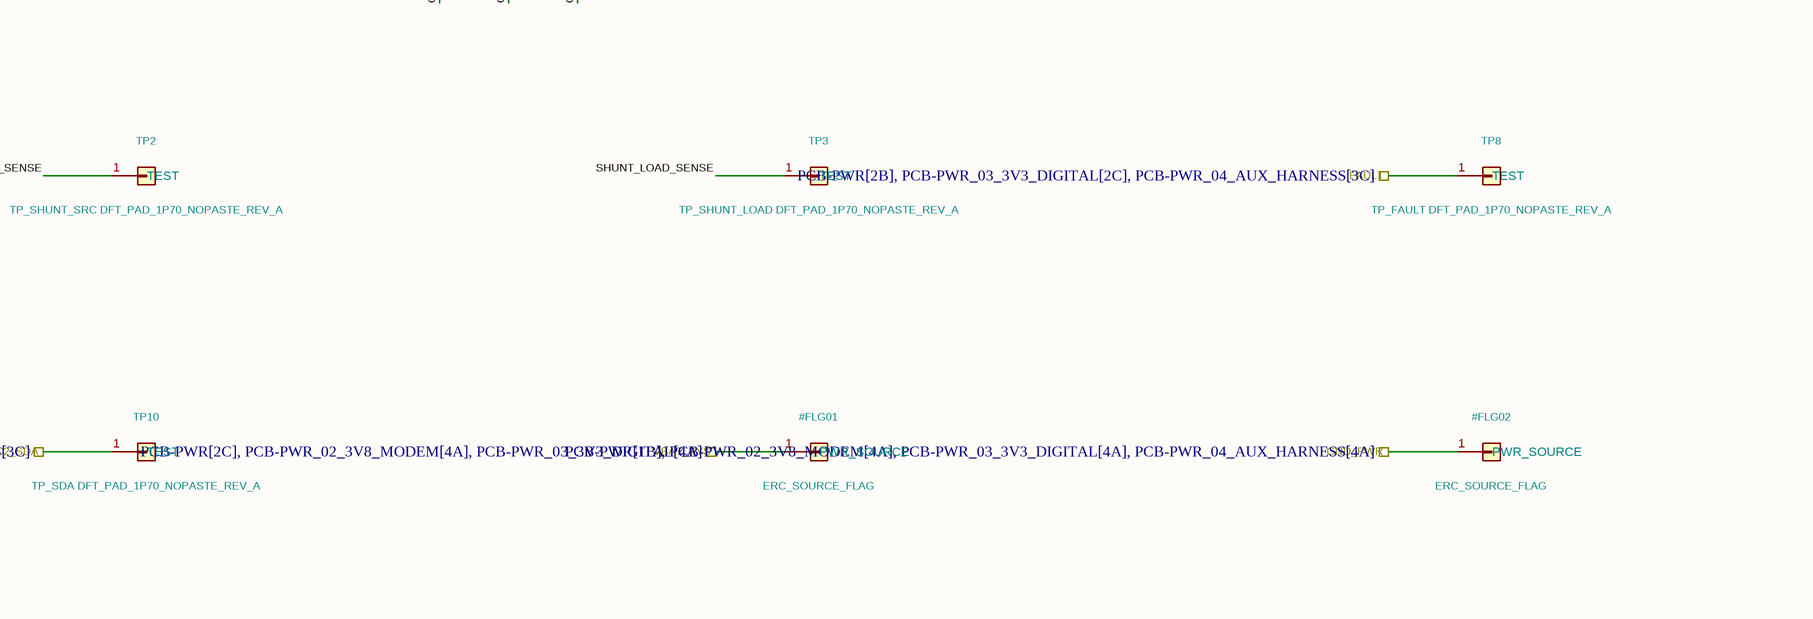
[diagram p11: PCB-PWR_01_INPUT_PROTECTION.SchDoc, bottom right]

### Parts
#FLG01  ERC_SOURCE_FLAG
#FLG02  ERC_SOURCE_FLAG
C1  100 nF 25 V X7R CGA2B3X7R1E104K050BB  [C_0402_1005Metric]
C2  100 nF 25 V X7R CGA2B3X7R1E104K050BB  [C_0402_1005Metric]
C9  100 nF 50 V X7R CGA3E2X7R1H104K080AA  [C_0603_1608Metric]
C10  4.7 uF 50 V X7R CGA6P3X7R1H475K250AB  [C_1210_3225Metric]
C13  100 uF 35 V hybrid EEH-ZK1V101XP  [CP_Elec_6.3x7.7]
D1  SMBJ18A CANDIDATE UNIDIRECTIONAL TVS  [D_SMB]
F1  0451008.MRL  [Fuse_1206_3216Metric]
J1  PWR_INPUT_43045-0213  [Molex_43045-0213_MicroFit-2_Vertical]
Q1  CSD18540Q5B  [CSD18540Q5B_DNK]
RSH1  WSK2512R0100FEA 10mOhm 1% 1W 4T  [Vishay_WSK2512_4T_T1.19mm]
TP1  TP_VBAT_PROTECTED DFT_PAD_1P70_NOPASTE_REV_A  [TestPoint_DFT_1.7mm_NoPaste]
TP2  TP_SHUNT_SRC DFT_PAD_1P70_NOPASTE_REV_A  [TestPoint_DFT_1.7mm_NoPaste]
TP3  TP_SHUNT_LOAD DFT_PAD_1P70_NOPASTE_REV_A  [TestPoint_DFT_1.7mm_NoPaste]
TP8  TP_FAULT DFT_PAD_1P70_NOPASTE_REV_A  [TestPoint_DFT_1.7mm_NoPaste]
TP9  TP_SCL DFT_PAD_1P70_NOPASTE_REV_A  [TestPoint_DFT_1.7mm_NoPaste]
TP10  TP_SDA DFT_PAD_1P70_NOPASTE_REV_A  [TestPoint_DFT_1.7mm_NoPaste]
U1  LM74700QDBVRQ1  [TI_DBV0006A_SOT23-6]
U2  INA226AIDGSR  [TI_DGS0010A_VSSOP10]

### Ports
3V3_DIGITAL (see PCB-PWR[1B], PCB-PWR_02_3V8_MODEM[4C], PCB-PWR_03_3V3_DIGITAL[1D], PCB-PWR_04_AUX_HARNESS[3A]), FAULT (see PCB-PWR[2B], PCB-PWR_03_3V3_DIGITAL[2C], PCB-PWR_04_AUX_HARNESS[3C]), GND_PWR (see PCB-PWR[1B], PCB-PWR_02_3V8_MODEM[4A], PCB-PWR_03_3V3_DIGITAL[4A], PCB-PWR_04_AUX_HARNESS[4A]), I2C2_SCL (see PCB-PWR[2B], PCB-PWR_03_3V3_DIGITAL[3C], PCB-PWR_04_AUX_HARNESS[3C]), I2C2_SDA (see PCB-PWR[1C], PCB-PWR_03_3V3_DIGITAL[4C], PCB-PWR_04_AUX_HARNESS[3C]), VBAT_SYS (see PCB-PWR[2C], PCB-PWR_02_3V8_MODEM[4A], PCB-PWR_03_3V3_DIGITAL[4A])

### Nets
3V3_DIGITAL: C2.1 ; port 3V3_DIGITAL
3V3_DIGITAL: U2.6(VS)  [a separate net that carries the same name]
FAULT: TP8.1(TEST) ; port FAULT
FAULT: U2.3(ALERT)  [a separate net that carries the same name]
GND_PWR: #FLG02.1(PWR_SOURCE) ; port GND_PWR
GND_PWR: C2.2 C9.2 C10.2 C13.2 D1.2(A) J1.2(VBAT_MINUS) U1.2(GND) U2.1(A1) U2.2(A0) U2.7(GND)  [a separate net that carries the same name]
I2C2_SCL: TP9.1(TEST) U2.5(SCL) ; port I2C2_SCL
I2C2_SDA: TP10.1(TEST) ; port I2C2_SDA
I2C2_SDA: U2.4(SDA)  [a separate net that carries the same name]
LM74700_VCAP: C1.1 U1.1(VCAP)
REV_GATE: Q1.4(GATE) U1.5(GATE)
SHUNT_LOAD_SENSE: RSH1.4(SENSE_LOAD) TP3.1(TEST) U2.9(IN-)
SHUNT_SOURCE_SENSE: RSH1.3(SENSE_SOURCE) TP2.1(TEST) U2.10(IN+)
VBAT_FUSED: C1.2 C9.1 D1.1(K) F1.2 Q1.1(SOURCE) Q1.2(SOURCE) Q1.3(SOURCE) U1.3(EN) U1.6(ANODE)
VBAT_PROTECTED: C10.1 Q1.5(DRAIN) Q1.6(DRAIN) Q1.7(DRAIN) Q1.8(DRAIN) RSH1.1(CURRENT_SOURCE) TP1.1(TEST) U1.4(CATHODE)
VBAT_RAW: F1.1 J1.1(VBAT_PLUS)
VBAT_SYS: #FLG01.1(PWR_SOURCE) ; port VBAT_SYS
VBAT_SYS: C13.1 RSH1.2(CURRENT_LOAD) U2.8(VBUS)  [a separate net that carries the same name]

### Notes on the sheet
- Explicit wire stubs expose every reviewed pin/net connection. Hierarchical labels are the only cross-sheet connections.
- 1
- 2
- 3
- 4
- 5
- 6
- 7
- 8
- A
- B
- C
- D
- E
- Human-readable hierarchy; exact pin/net equivalence enforced
- Functional sheet 2 of 5
- NOT FOR MANUFACTURE - routing/DRC/DFM/Review B pending
- Title: Input protection + monitor
- File: PCB-PWR_01_INPUT_PROTECTION.kicad_sch
- Sheet: /
- Dioneya / ZS-BPLA
- F
- KiCad E.D.A.  kicad (5.1.4)-1
- Size: A3
- Date: 2026-09-17
- Rev: A
- Id: 1/1

### Library data of the parts
C1 C2 C9 C10 C13 = C
  C1 C2: Value: 100 nF 25 V X7R CGA2B3X7R1E104K050BB; Footprint: Capacitor_SMD:C_0402_1005Metric
  C9: Value: 100 nF 50 V X7R CGA3E2X7R1H104K080AA; Footprint: Capacitor_SMD:C_0603_1608Metric
  C10: Value: 4.7 uF 50 V X7R CGA6P3X7R1H475K250AB; Footprint: Capacitor_SMD:C_1210_3225Metric
  C13: Value: 100 uF 35 V hybrid EEH-ZK1V101XP; Footprint: Capacitor_SMD:CP_Elec_6.3x7.7
D1 = D_Zener: Value: SMBJ18A CANDIDATE UNIDIRECTIONAL TVS; Footprint: Diode_SMD:D_SMB
F1 = Fuse: Value: 0451008.MRL; Footprint: Fuse:Fuse_1206_3216Metric
J1 = Conn_01x02: Value: PWR_INPUT_43045-0213; Footprint: DioneyaPWR:Molex_43045-0213_MicroFit-2_Vertical
Q1 = Conn_01x08: Value: CSD18540Q5B; Footprint: DioneyaPWR:CSD18540Q5B_DNK
RSH1 = Conn_01x04: Value: WSK2512R0100FEA 10mOhm 1% 1W 4T; Footprint: DioneyaPWR:Vishay_WSK2512_4T_T1.19mm
TP1-TP3 TP8-TP10 = TESTPOINT: Footprint: DioneyaPWR:TestPoint_DFT_1.7mm_NoPaste
  TP1: Value: TP_VBAT_PROTECTED DFT_PAD_1P70_NOPASTE_REV_A
  TP2: Value: TP_SHUNT_SRC DFT_PAD_1P70_NOPASTE_REV_A
  TP3: Value: TP_SHUNT_LOAD DFT_PAD_1P70_NOPASTE_REV_A
  TP8: Value: TP_FAULT DFT_PAD_1P70_NOPASTE_REV_A
  TP9: Value: TP_SCL DFT_PAD_1P70_NOPASTE_REV_A
  TP10: Value: TP_SDA DFT_PAD_1P70_NOPASTE_REV_A
U1 = Conn_01x06: Value: LM74700QDBVRQ1; Footprint: DioneyaPWR:TI_DBV0006A_SOT23-6
U2 = Conn_01x10: Value: INA226AIDGSR; Footprint: DioneyaPWR:TI_DGS0010A_VSSOP10
#FLG01 #FLG02 = ERC_SOURCE_FLAG: Value: ERC_SOURCE_FLAG

## Sheet PCB-PWR_02_3V8_MODEM.SchDoc
size 420 x 297 mm
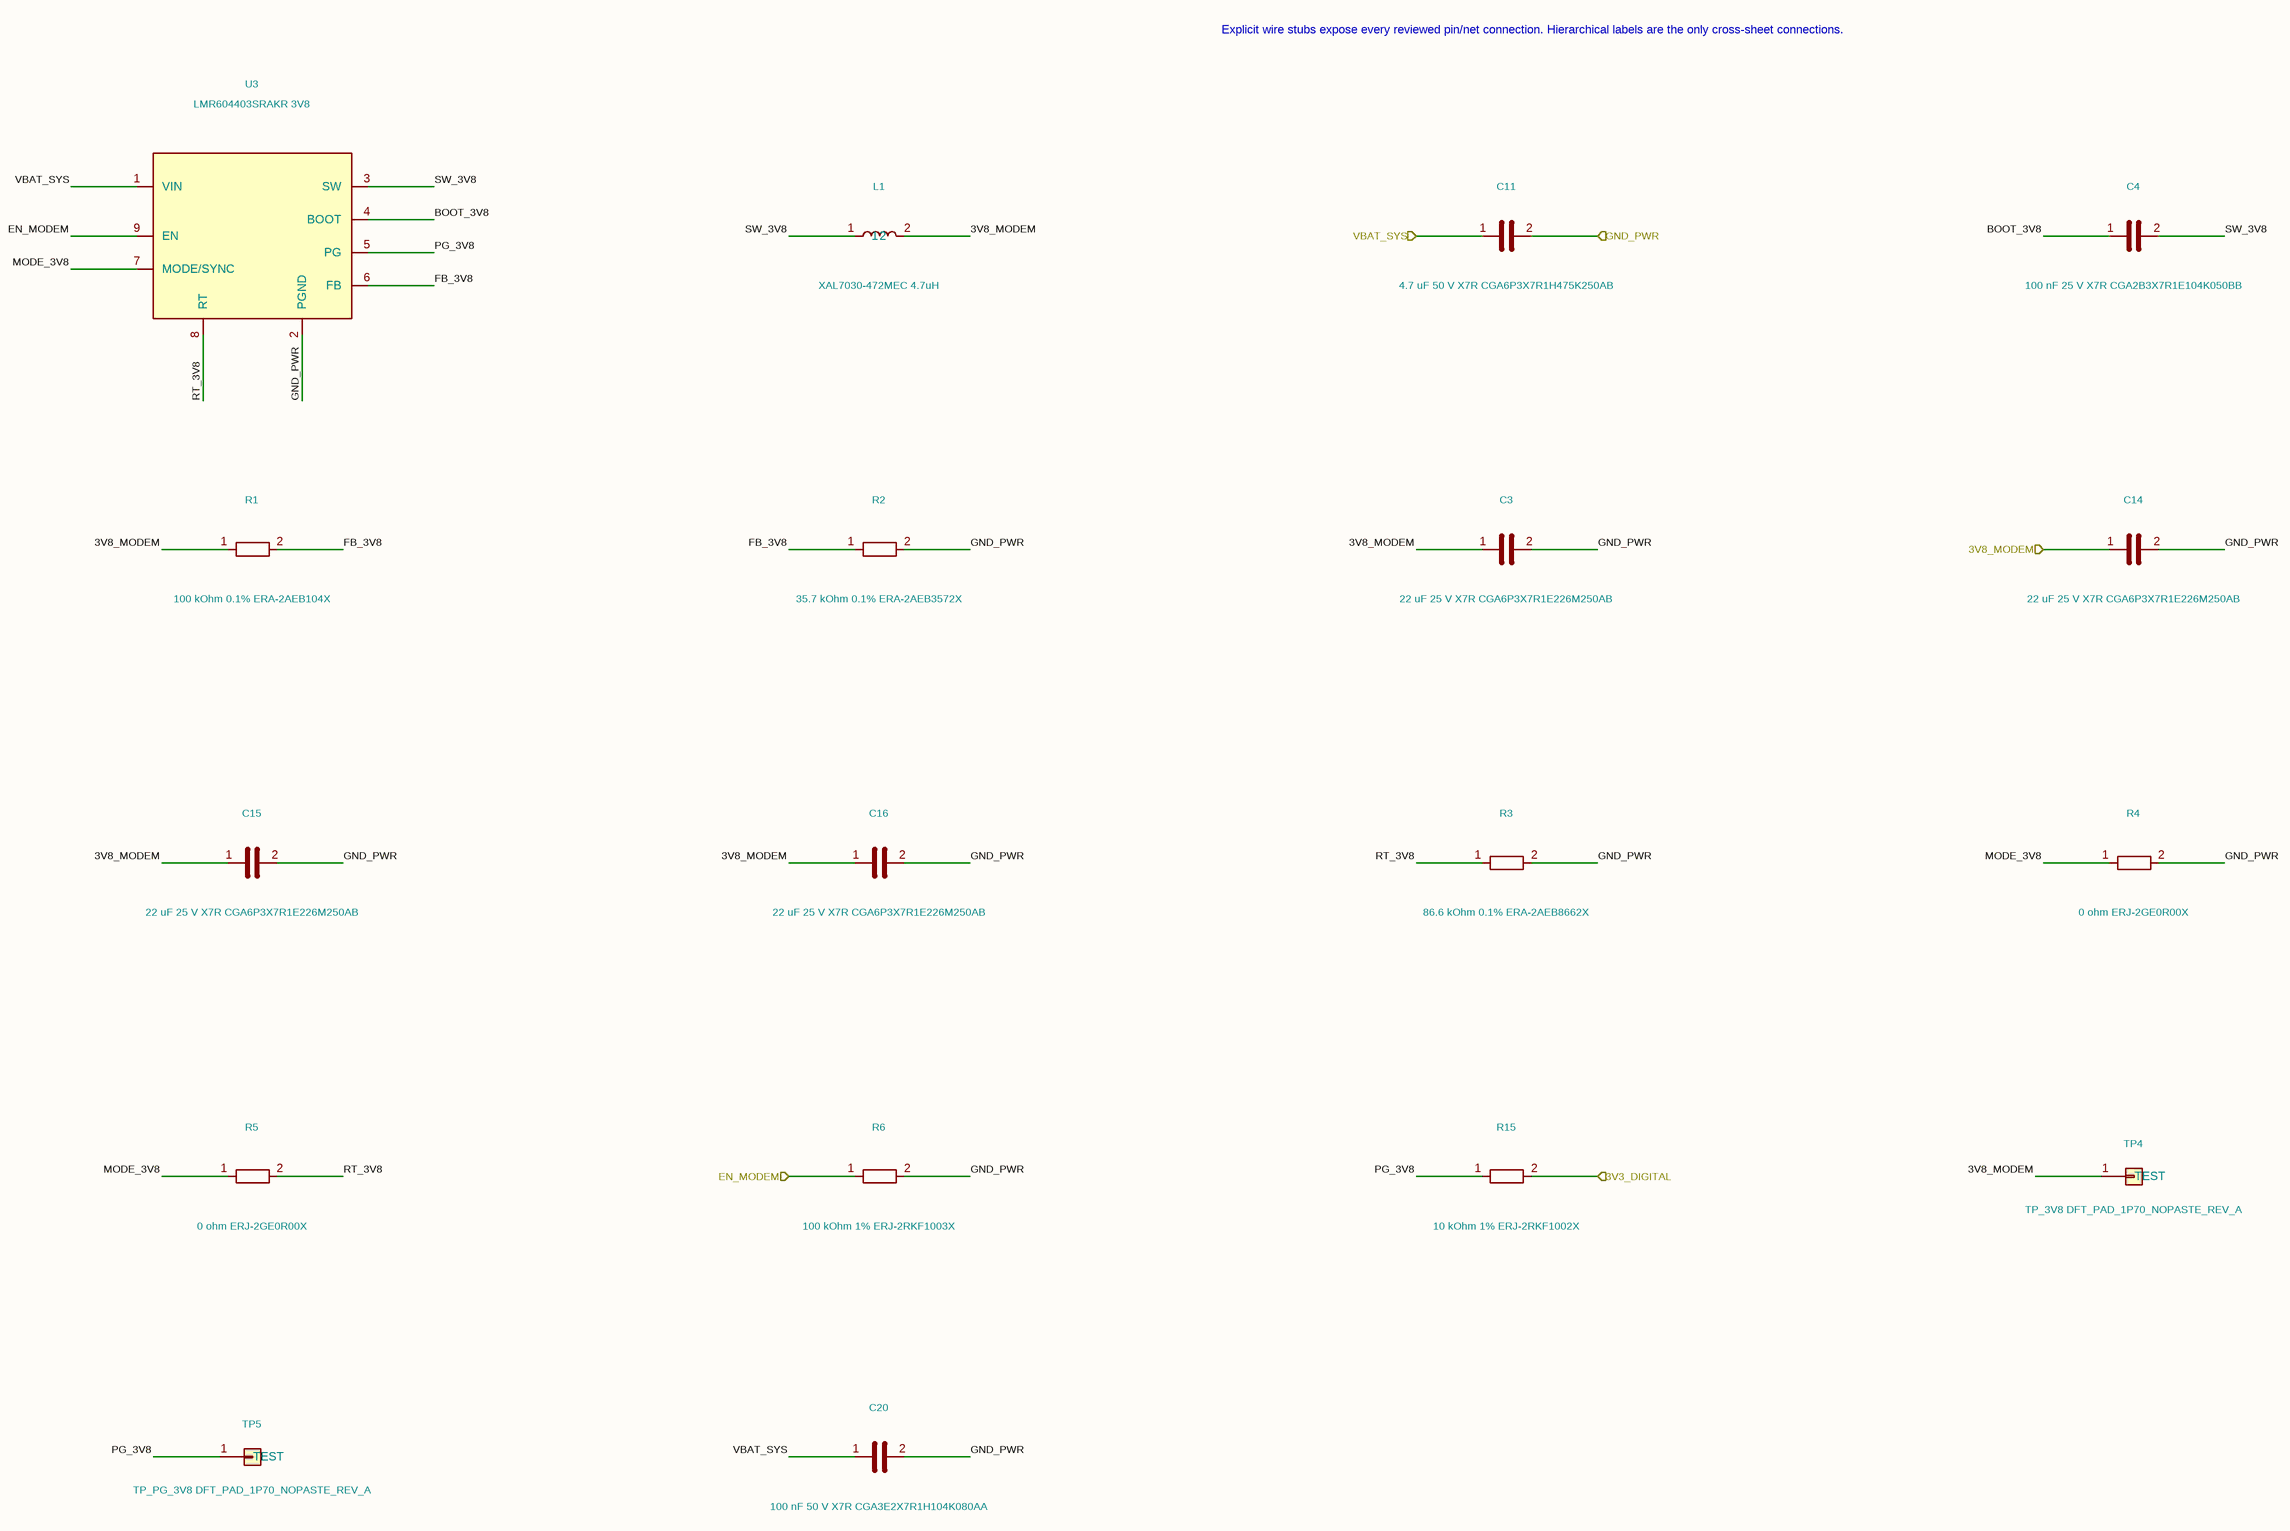
[diagram p12: PCB-PWR_02_3V8_MODEM.SchDoc]

### Parts
C3  22 uF 25 V X7R CGA6P3X7R1E226M250AB  [C_1210_3225Metric]
C4  100 nF 25 V X7R CGA2B3X7R1E104K050BB  [C_0402_1005Metric]
C11  4.7 uF 50 V X7R CGA6P3X7R1H475K250AB  [C_1210_3225Metric]
C14  22 uF 25 V X7R CGA6P3X7R1E226M250AB  [C_1210_3225Metric]
C15  22 uF 25 V X7R CGA6P3X7R1E226M250AB  [C_1210_3225Metric]
C16  22 uF 25 V X7R CGA6P3X7R1E226M250AB  [C_1210_3225Metric]
C20  100 nF 50 V X7R CGA3E2X7R1H104K080AA  [C_0603_1608Metric]
L1  XAL7030-472MEC 4.7uH  [Coilcraft_XAL7030_472]
R1  100 kOhm 0.1% ERA-2AEB104X  [R_0402_1005Metric]
R2  35.7 kOhm 0.1% ERA-2AEB3572X  [R_0402_1005Metric]
R3  86.6 kOhm 0.1% ERA-2AEB8662X  [R_0402_1005Metric]
R4  0 ohm ERJ-2GE0R00X  [R_0402_1005Metric]
R5  0 ohm ERJ-2GE0R00X  [R_0402_1005Metric]
R6  100 kOhm 1% ERJ-2RKF1003X  [R_0402_1005Metric]
R15  10 kOhm 1% ERJ-2RKF1002X  [R_0402_1005Metric]
TP4  TP_3V8 DFT_PAD_1P70_NOPASTE_REV_A  [TestPoint_DFT_1.7mm_NoPaste]
TP5  TP_PG_3V8 DFT_PAD_1P70_NOPASTE_REV_A  [TestPoint_DFT_1.7mm_NoPaste]
U3  LMR604403SRAKR 3V8  [LMR60440_RAK0009A]

### Ports
3V3_DIGITAL, 3V8_MODEM, EN_MODEM, GND_PWR, VBAT_SYS

### Nets
3V3_DIGITAL: R15.2 ; port 3V3_DIGITAL
3V8_MODEM: C14.1 ; port 3V8_MODEM
3V8_MODEM: C3.1 C15.1 C16.1 L1.2 R1.1 TP4.1(TEST)  [a separate net that carries the same name]
BOOT_3V8: C4.1 U3.4(BOOT)
EN_MODEM: R6.1 ; port EN_MODEM
EN_MODEM: U3.9(EN)  [a separate net that carries the same name]
FB_3V8: R1.2 R2.1 U3.6(FB)
GND_PWR: C11.2 ; port GND_PWR
GND_PWR: C3.2 C14.2 C15.2 C16.2 C20.2 R2.2 R3.2 R4.2 R6.2 U3.2(PGND)  [a separate net that carries the same name]
MODE_3V8: R4.1 R5.1 U3.7(MODE/SYNC)
PG_3V8: R15.1 TP5.1(TEST) U3.5(PG)
RT_3V8: R3.1 R5.2 U3.8(RT)
SW_3V8: C4.2 L1.1 U3.3(SW)
VBAT_SYS: C11.1 ; port VBAT_SYS
VBAT_SYS: C20.1 U3.1(VIN)  [a separate net that carries the same name]

### Notes on the sheet
- Explicit wire stubs expose every reviewed pin/net connection. Hierarchical labels are the only cross-sheet connections.
- 1
- 2
- 3
- 4
- 5
- 6
- 7
- 8
- A
- B
- C
- D
- E
- Human-readable hierarchy; exact pin/net equivalence enforced
- Functional sheet 3 of 5
- NOT FOR MANUFACTURE - routing/DRC/DFM/Review B pending
- Title: 3V8 modem rail
- File: PCB-PWR_02_3V8_MODEM.kicad_sch
- Sheet: /
- Dioneya / ZS-BPLA
- F
- KiCad E.D.A.  kicad (5.1.4)-1
- Size: A3
- Date: 2026-09-17
- Rev: A
- Id: 1/1

### Library data of the parts
C3 C4 C11 C14-C16 C20 = C
  C3 C14-C16: Value: 22 uF 25 V X7R CGA6P3X7R1E226M250AB; Footprint: Capacitor_SMD:C_1210_3225Metric
  C4: Value: 100 nF 25 V X7R CGA2B3X7R1E104K050BB; Footprint: Capacitor_SMD:C_0402_1005Metric
  C11: Value: 4.7 uF 50 V X7R CGA6P3X7R1H475K250AB; Footprint: Capacitor_SMD:C_1210_3225Metric
  C20: Value: 100 nF 50 V X7R CGA3E2X7R1H104K080AA; Footprint: Capacitor_SMD:C_0603_1608Metric
L1 = L: Value: XAL7030-472MEC 4.7uH; Footprint: DioneyaPWR:Coilcraft_XAL7030_472
R1-R6 R15 = R: Footprint: Resistor_SMD:R_0402_1005Metric
  R1: Value: 100 kOhm 0.1% ERA-2AEB104X
  R2: Value: 35.7 kOhm 0.1% ERA-2AEB3572X
  R3: Value: 86.6 kOhm 0.1% ERA-2AEB8662X
  R4 R5: Value: 0 ohm ERJ-2GE0R00X
  R6: Value: 100 kOhm 1% ERJ-2RKF1003X
  R15: Value: 10 kOhm 1% ERJ-2RKF1002X
TP4 TP5 = TESTPOINT: Footprint: DioneyaPWR:TestPoint_DFT_1.7mm_NoPaste
  TP4: Value: TP_3V8 DFT_PAD_1P70_NOPASTE_REV_A
  TP5: Value: TP_PG_3V8 DFT_PAD_1P70_NOPASTE_REV_A
U3 = Conn_01x09: Value: LMR604403SRAKR 3V8; Footprint: DioneyaPWR:LMR60440_RAK0009A

## Sheet PCB-PWR_03_3V3_DIGITAL.SchDoc
size 420 x 297 mm
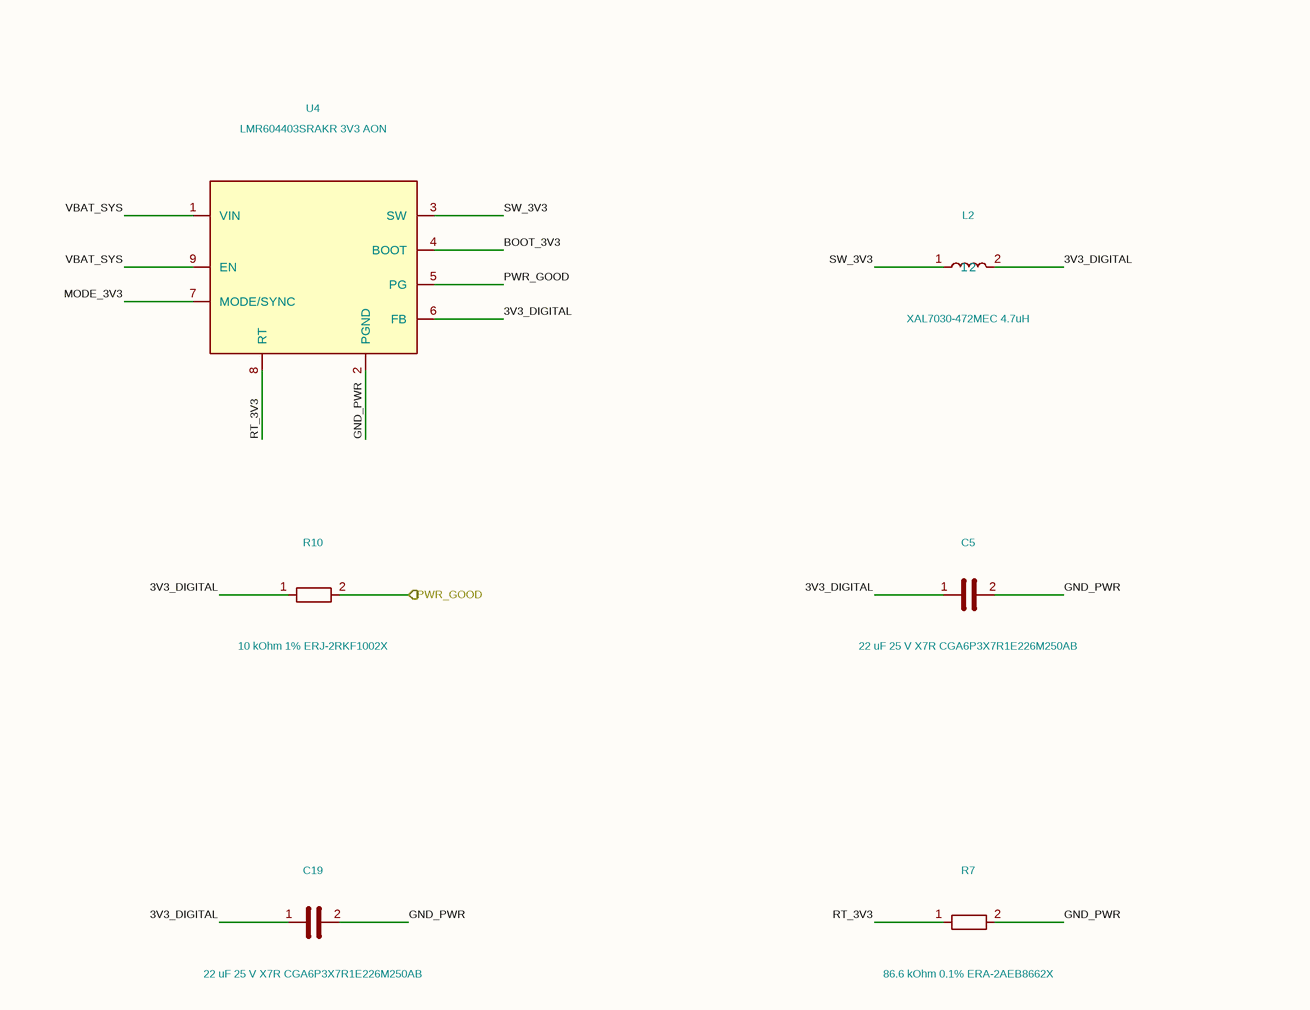
[diagram p13: PCB-PWR_03_3V3_DIGITAL.SchDoc, top left]
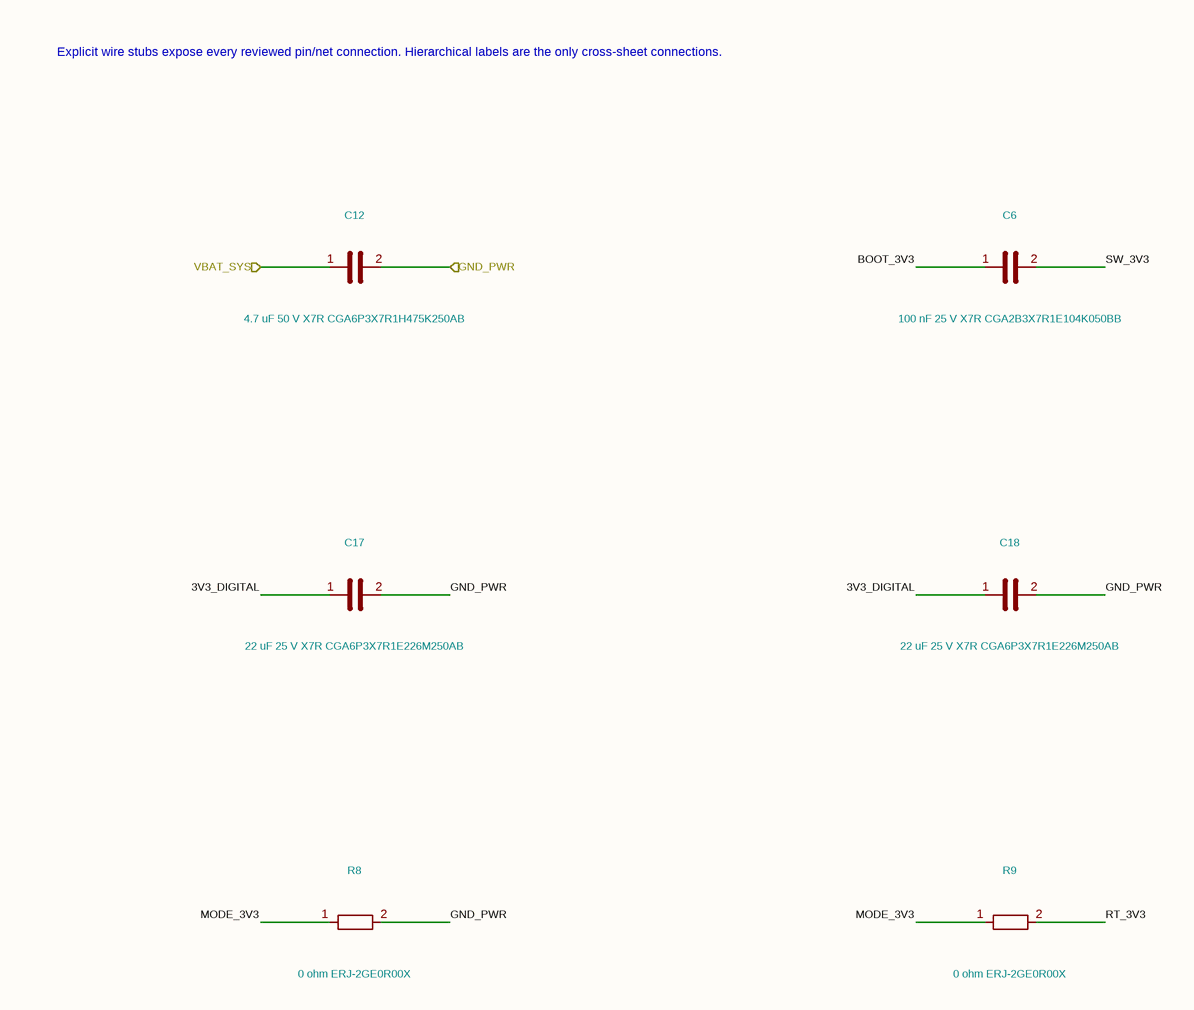
[diagram p14: PCB-PWR_03_3V3_DIGITAL.SchDoc, top right]
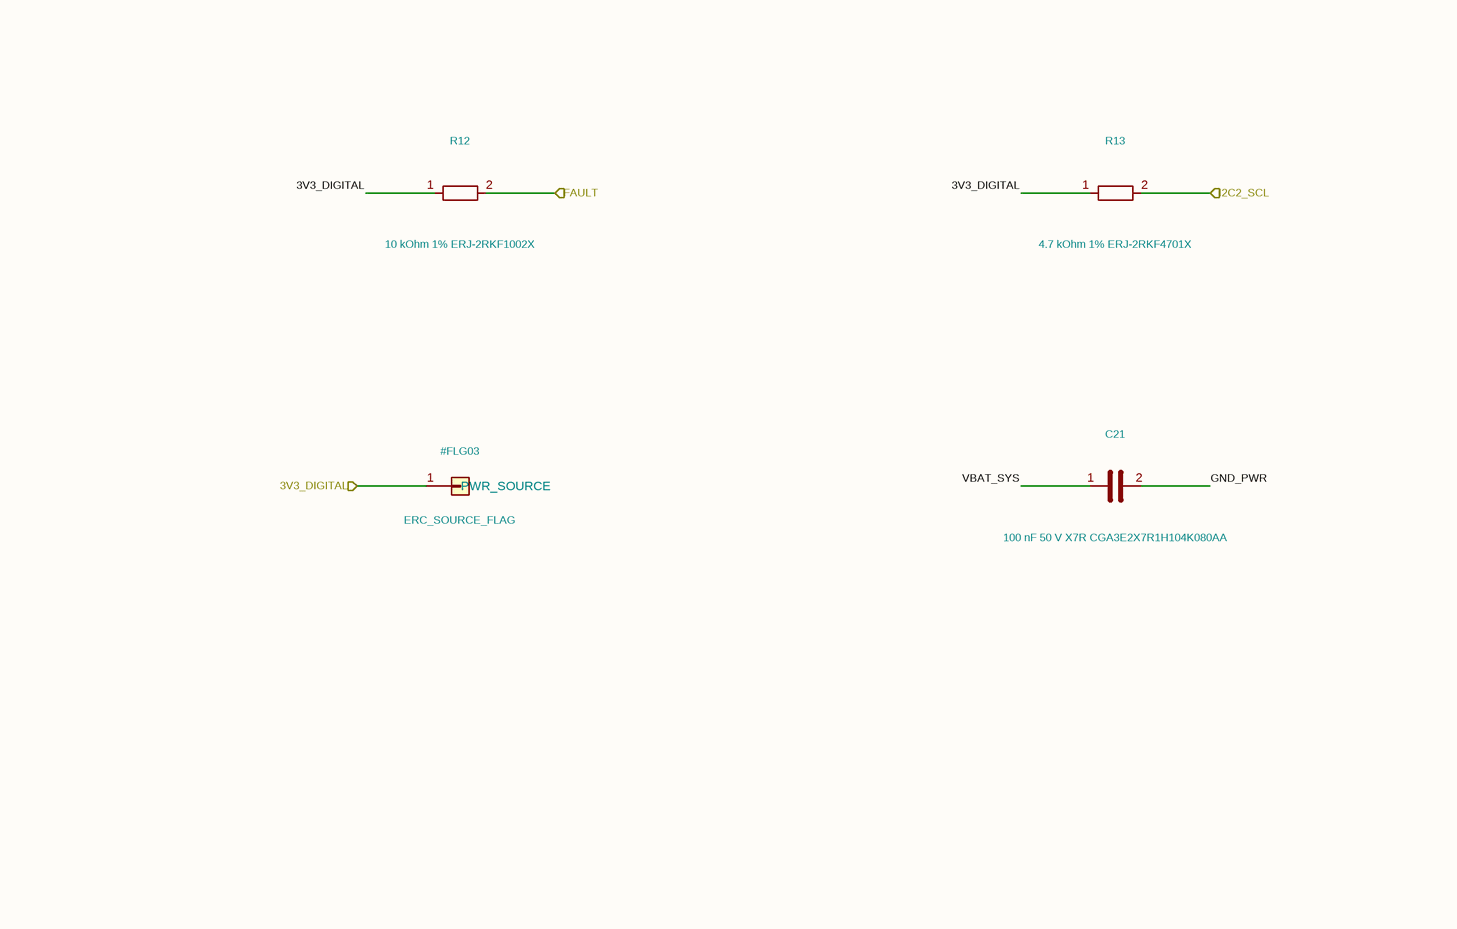
[diagram p15: PCB-PWR_03_3V3_DIGITAL.SchDoc, bottom left]
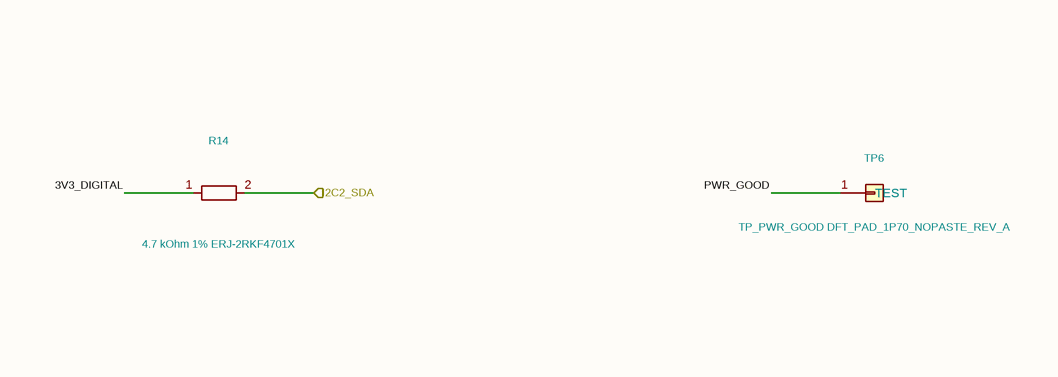
[diagram p16: PCB-PWR_03_3V3_DIGITAL.SchDoc, bottom right]

### Parts
#FLG03  ERC_SOURCE_FLAG
C5  22 uF 25 V X7R CGA6P3X7R1E226M250AB  [C_1210_3225Metric]
C6  100 nF 25 V X7R CGA2B3X7R1E104K050BB  [C_0402_1005Metric]
C12  4.7 uF 50 V X7R CGA6P3X7R1H475K250AB  [C_1210_3225Metric]
C17  22 uF 25 V X7R CGA6P3X7R1E226M250AB  [C_1210_3225Metric]
C18  22 uF 25 V X7R CGA6P3X7R1E226M250AB  [C_1210_3225Metric]
C19  22 uF 25 V X7R CGA6P3X7R1E226M250AB  [C_1210_3225Metric]
C21  100 nF 50 V X7R CGA3E2X7R1H104K080AA  [C_0603_1608Metric]
L2  XAL7030-472MEC 4.7uH  [Coilcraft_XAL7030_472]
R7  86.6 kOhm 0.1% ERA-2AEB8662X  [R_0402_1005Metric]
R8  0 ohm ERJ-2GE0R00X  [R_0402_1005Metric]
R9  0 ohm ERJ-2GE0R00X  [R_0402_1005Metric]
R10  10 kOhm 1% ERJ-2RKF1002X  [R_0402_1005Metric]
R12  10 kOhm 1% ERJ-2RKF1002X  [R_0402_1005Metric]
R13  4.7 kOhm 1% ERJ-2RKF4701X  [R_0402_1005Metric]
R14  4.7 kOhm 1% ERJ-2RKF4701X  [R_0402_1005Metric]
TP6  TP_PWR_GOOD DFT_PAD_1P70_NOPASTE_REV_A  [TestPoint_DFT_1.7mm_NoPaste]
U4  LMR604403SRAKR 3V3 AON  [LMR60440_RAK0009A]

### Ports
3V3_DIGITAL, FAULT, GND_PWR, I2C2_SCL, I2C2_SDA, PWR_GOOD, VBAT_SYS

### Nets
3V3_DIGITAL: #FLG03.1(PWR_SOURCE) ; port 3V3_DIGITAL
3V3_DIGITAL: C5.1 C17.1 C18.1 C19.1 L2.2 R10.1 R12.1 R13.1 R14.1 U4.6(FB)  [a separate net that carries the same name]
BOOT_3V3: C6.1 U4.4(BOOT)
FAULT: R12.2 ; port FAULT
GND_PWR: C12.2 ; port GND_PWR
GND_PWR: C5.2 C17.2 C18.2 C19.2 C21.2 R7.2 R8.2 U4.2(PGND)  [a separate net that carries the same name]
I2C2_SCL: R13.2 ; port I2C2_SCL
I2C2_SDA: R14.2 ; port I2C2_SDA
MODE_3V3: R8.1 R9.1 U4.7(MODE/SYNC)
PWR_GOOD: R10.2 ; port PWR_GOOD
PWR_GOOD: TP6.1(TEST) U4.5(PG)  [a separate net that carries the same name]
RT_3V3: R7.1 R9.2 U4.8(RT)
SW_3V3: C6.2 L2.1 U4.3(SW)
VBAT_SYS: C12.1 ; port VBAT_SYS
VBAT_SYS: C21.1 U4.1(VIN) U4.9(EN)  [a separate net that carries the same name]

### Notes on the sheet
- Explicit wire stubs expose every reviewed pin/net connection. Hierarchical labels are the only cross-sheet connections.
- 1
- 2
- 3
- 4
- 5
- 6
- 7
- 8
- A
- B
- C
- D
- E
- Human-readable hierarchy; exact pin/net equivalence enforced
- Functional sheet 4 of 5
- NOT FOR MANUFACTURE - routing/DRC/DFM/Review B pending
- Title: 3V3 AON rail
- File: PCB-PWR_03_3V3_DIGITAL.kicad_sch
- Sheet: /
- Dioneya / ZS-BPLA
- F
- KiCad E.D.A.  kicad (5.1.4)-1
- Size: A3
- Date: 2026-09-17
- Rev: A
- Id: 1/1

### Library data of the parts
C5 C6 C12 C17-C19 C21 = C
  C5 C17-C19: Value: 22 uF 25 V X7R CGA6P3X7R1E226M250AB; Footprint: Capacitor_SMD:C_1210_3225Metric
  C6: Value: 100 nF 25 V X7R CGA2B3X7R1E104K050BB; Footprint: Capacitor_SMD:C_0402_1005Metric
  C12: Value: 4.7 uF 50 V X7R CGA6P3X7R1H475K250AB; Footprint: Capacitor_SMD:C_1210_3225Metric
  C21: Value: 100 nF 50 V X7R CGA3E2X7R1H104K080AA; Footprint: Capacitor_SMD:C_0603_1608Metric
L2 = L: Value: XAL7030-472MEC 4.7uH; Footprint: DioneyaPWR:Coilcraft_XAL7030_472
R7-R10 R12-R14 = R: Footprint: Resistor_SMD:R_0402_1005Metric
  R7: Value: 86.6 kOhm 0.1% ERA-2AEB8662X
  R8 R9: Value: 0 ohm ERJ-2GE0R00X
  R10 R12: Value: 10 kOhm 1% ERJ-2RKF1002X
  R13 R14: Value: 4.7 kOhm 1% ERJ-2RKF4701X
TP6 = TESTPOINT: Value: TP_PWR_GOOD DFT_PAD_1P70_NOPASTE_REV_A; Footprint: DioneyaPWR:TestPoint_DFT_1.7mm_NoPaste
U4 = Conn_01x09: Value: LMR604403SRAKR 3V3 AON; Footprint: DioneyaPWR:LMR60440_RAK0009A
#FLG03 = ERC_SOURCE_FLAG: Value: ERC_SOURCE_FLAG

## Sheet PCB-PWR_04_AUX_HARNESS.SchDoc
size 420 x 297 mm
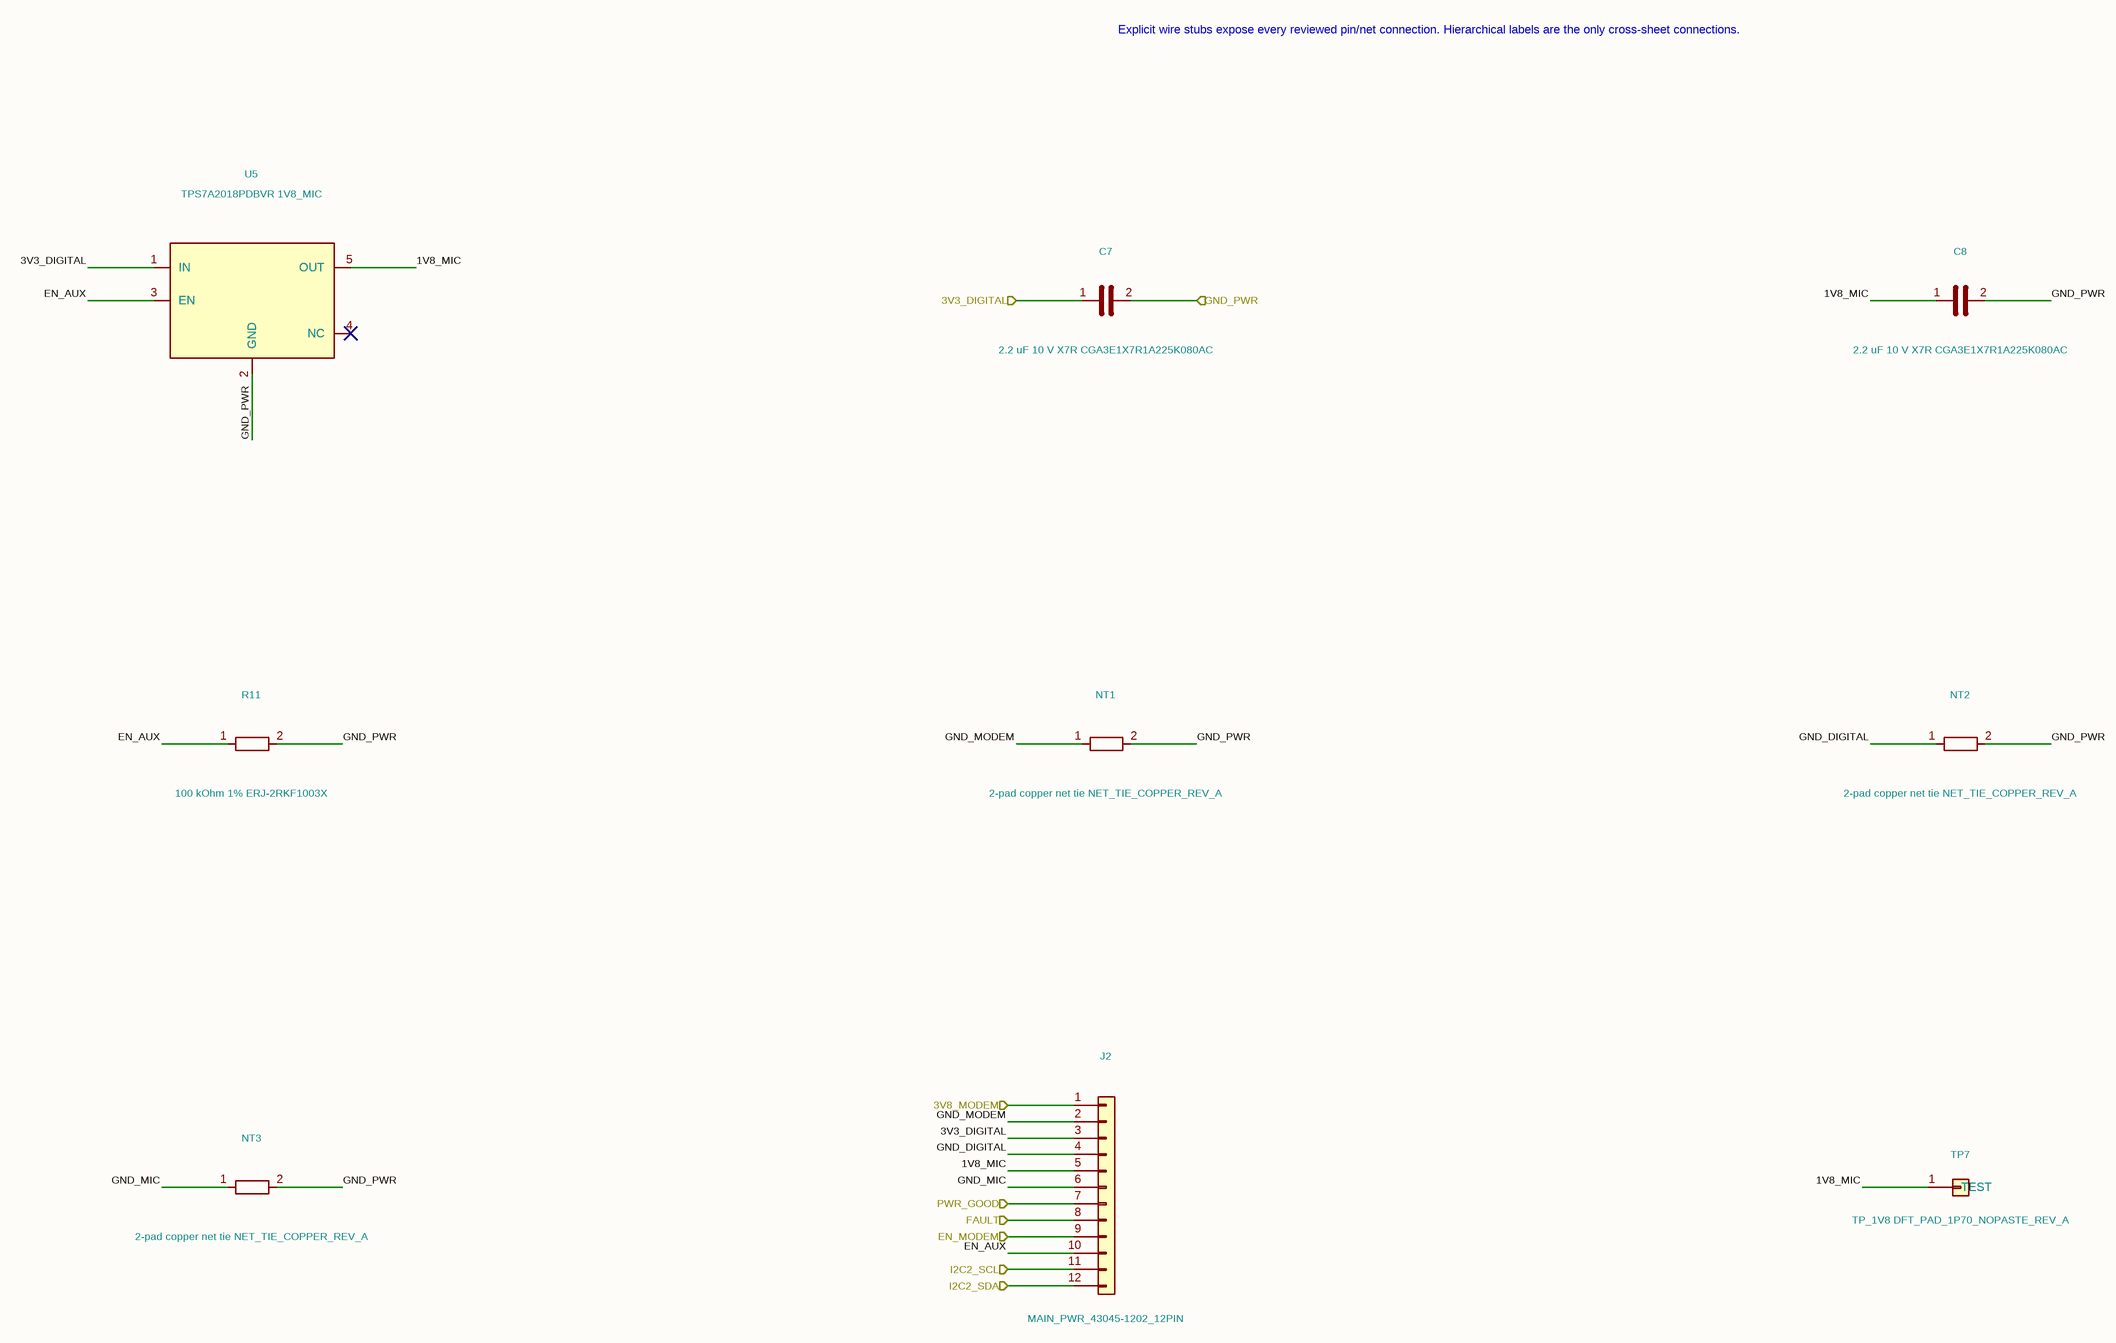
[diagram p17: PCB-PWR_04_AUX_HARNESS.SchDoc]

### Parts
C7  2.2 uF 10 V X7R CGA3E1X7R1A225K080AC  [C_0603_1608Metric]
C8  2.2 uF 10 V X7R CGA3E1X7R1A225K080AC  [C_0603_1608Metric]
J2  MAIN_PWR_43045-1202_12PIN  [Molex_43045-1202_MicroFit-12_RA]
NT1  2-pad copper net tie NET_TIE_COPPER_REV_A  [NetTie-2_SMD_Pad0.5mm]
NT2  2-pad copper net tie NET_TIE_COPPER_REV_A  [NetTie-2_SMD_Pad0.5mm]
NT3  2-pad copper net tie NET_TIE_COPPER_REV_A  [NetTie-2_SMD_Pad0.5mm]
R11  100 kOhm 1% ERJ-2RKF1003X  [R_0402_1005Metric]
TP7  TP_1V8 DFT_PAD_1P70_NOPASTE_REV_A  [TestPoint_DFT_1.7mm_NoPaste]
U5  TPS7A2018PDBVR 1V8_MIC  [TI_DBV0005A_SOT23-5]

### Ports
3V3_DIGITAL, 3V8_MODEM, EN_MODEM, FAULT, GND_PWR, I2C2_SCL, I2C2_SDA, PWR_GOOD

### Nets
1V8_MIC: C8.1 J2.5(1V8_MIC) TP7.1(TEST) U5.5(OUT)
3V3_DIGITAL: C7.1 ; port 3V3_DIGITAL
3V3_DIGITAL: J2.3(3V3_DIGITAL) U5.1(IN)  [a separate net that carries the same name]
3V8_MODEM: J2.1(3V8_MODEM) ; port 3V8_MODEM
EN_AUX: J2.10(EN_AUX) R11.1 U5.3(EN)
EN_MODEM: J2.9(EN_MODEM) ; port EN_MODEM
FAULT: J2.8(FAULT) ; port FAULT
GND_DIGITAL: J2.4(GND_DIGITAL) NT2.1
GND_MIC: J2.6(GND_MIC) NT3.1
GND_MODEM: J2.2(GND_MODEM) NT1.1
GND_PWR: C7.2 ; port GND_PWR
GND_PWR: C8.2 NT1.2 NT2.2 NT3.2 R11.2 U5.2(GND)  [a separate net that carries the same name]
I2C2_SCL: J2.11(I2C2_SCL) ; port I2C2_SCL
I2C2_SDA: J2.12(I2C2_SDA) ; port I2C2_SDA
PWR_GOOD: J2.7(PWR_GOOD) ; port PWR_GOOD

Not connected (* = marked no-connect by the designer): U5 4(NC)*

### Notes on the sheet
- Explicit wire stubs expose every reviewed pin/net connection. Hierarchical labels are the only cross-sheet connections.
- 1
- 2
- 3
- 4
- 5
- 6
- 7
- 8
- A
- B
- C
- D
- E
- Human-readable hierarchy; exact pin/net equivalence enforced
- Functional sheet 5 of 5
- NOT FOR MANUFACTURE - routing/DRC/DFM/Review B pending
- Title: 1V8 + MAIN harness
- File: PCB-PWR_04_AUX_HARNESS.kicad_sch
- Sheet: /
- Dioneya / ZS-BPLA
- F
- KiCad E.D.A.  kicad (5.1.4)-1
- Size: A3
- Date: 2026-09-17
- Rev: A
- Id: 1/1

### Library data of the parts
C7 C8 = C: Value: 2.2 uF 10 V X7R CGA3E1X7R1A225K080AC; Footprint: Capacitor_SMD:C_0603_1608Metric
J2 = Conn_01x12: Value: MAIN_PWR_43045-1202_12PIN; Footprint: DioneyaMain:Molex_43045-1202_MicroFit-12_RA
NT1-NT3 R11 = R
  NT1-NT3: Value: 2-pad copper net tie NET_TIE_COPPER_REV_A; Footprint: NetTie:NetTie-2_SMD_Pad0.5mm
  R11: Value: 100 kOhm 1% ERJ-2RKF1003X; Footprint: Resistor_SMD:R_0402_1005Metric
TP7 = TESTPOINT: Value: TP_1V8 DFT_PAD_1P70_NOPASTE_REV_A; Footprint: DioneyaPWR:TestPoint_DFT_1.7mm_NoPaste
U5 = Conn_01x05: Value: TPS7A2018PDBVR 1V8_MIC; Footprint: DioneyaMain:TI_DBV0005A_SOT23-5

## Nets that join several sheets
3V3_DIGITAL: PCB-PWR_01_INPUT_PROTECTION (C2.1), PCB-PWR_02_3V8_MODEM (R15.2), PCB-PWR_03_3V3_DIGITAL (#FLG03.1), PCB-PWR_04_AUX_HARNESS (C7.1)
3V8_MODEM: PCB-PWR_02_3V8_MODEM (C14.1), PCB-PWR_04_AUX_HARNESS (J2.1)
EN_MODEM: PCB-PWR_02_3V8_MODEM (R6.1), PCB-PWR_04_AUX_HARNESS (J2.9)
FAULT: PCB-PWR_01_INPUT_PROTECTION (TP8.1), PCB-PWR_03_3V3_DIGITAL (R12.2), PCB-PWR_04_AUX_HARNESS (J2.8)
GND_PWR: PCB-PWR_01_INPUT_PROTECTION (#FLG02.1), PCB-PWR_02_3V8_MODEM (C11.2), PCB-PWR_03_3V3_DIGITAL (C12.2), PCB-PWR_04_AUX_HARNESS (C7.2)
I2C2_SCL: PCB-PWR_01_INPUT_PROTECTION (TP9.1 U2.5), PCB-PWR_03_3V3_DIGITAL (R13.2), PCB-PWR_04_AUX_HARNESS (J2.11)
I2C2_SDA: PCB-PWR_01_INPUT_PROTECTION (TP10.1), PCB-PWR_03_3V3_DIGITAL (R14.2), PCB-PWR_04_AUX_HARNESS (J2.12)
PWR_GOOD: PCB-PWR_03_3V3_DIGITAL (R10.2), PCB-PWR_04_AUX_HARNESS (J2.7)
VBAT_SYS: PCB-PWR_01_INPUT_PROTECTION (#FLG01.1), PCB-PWR_02_3V8_MODEM (C11.1), PCB-PWR_03_3V3_DIGITAL (C12.1)